# EAGLE schematic RU-PCBA-2X2-001-03 (EAGLE 9.7.0), part 3 of 5
## Sheet 7 of 17: Row 7
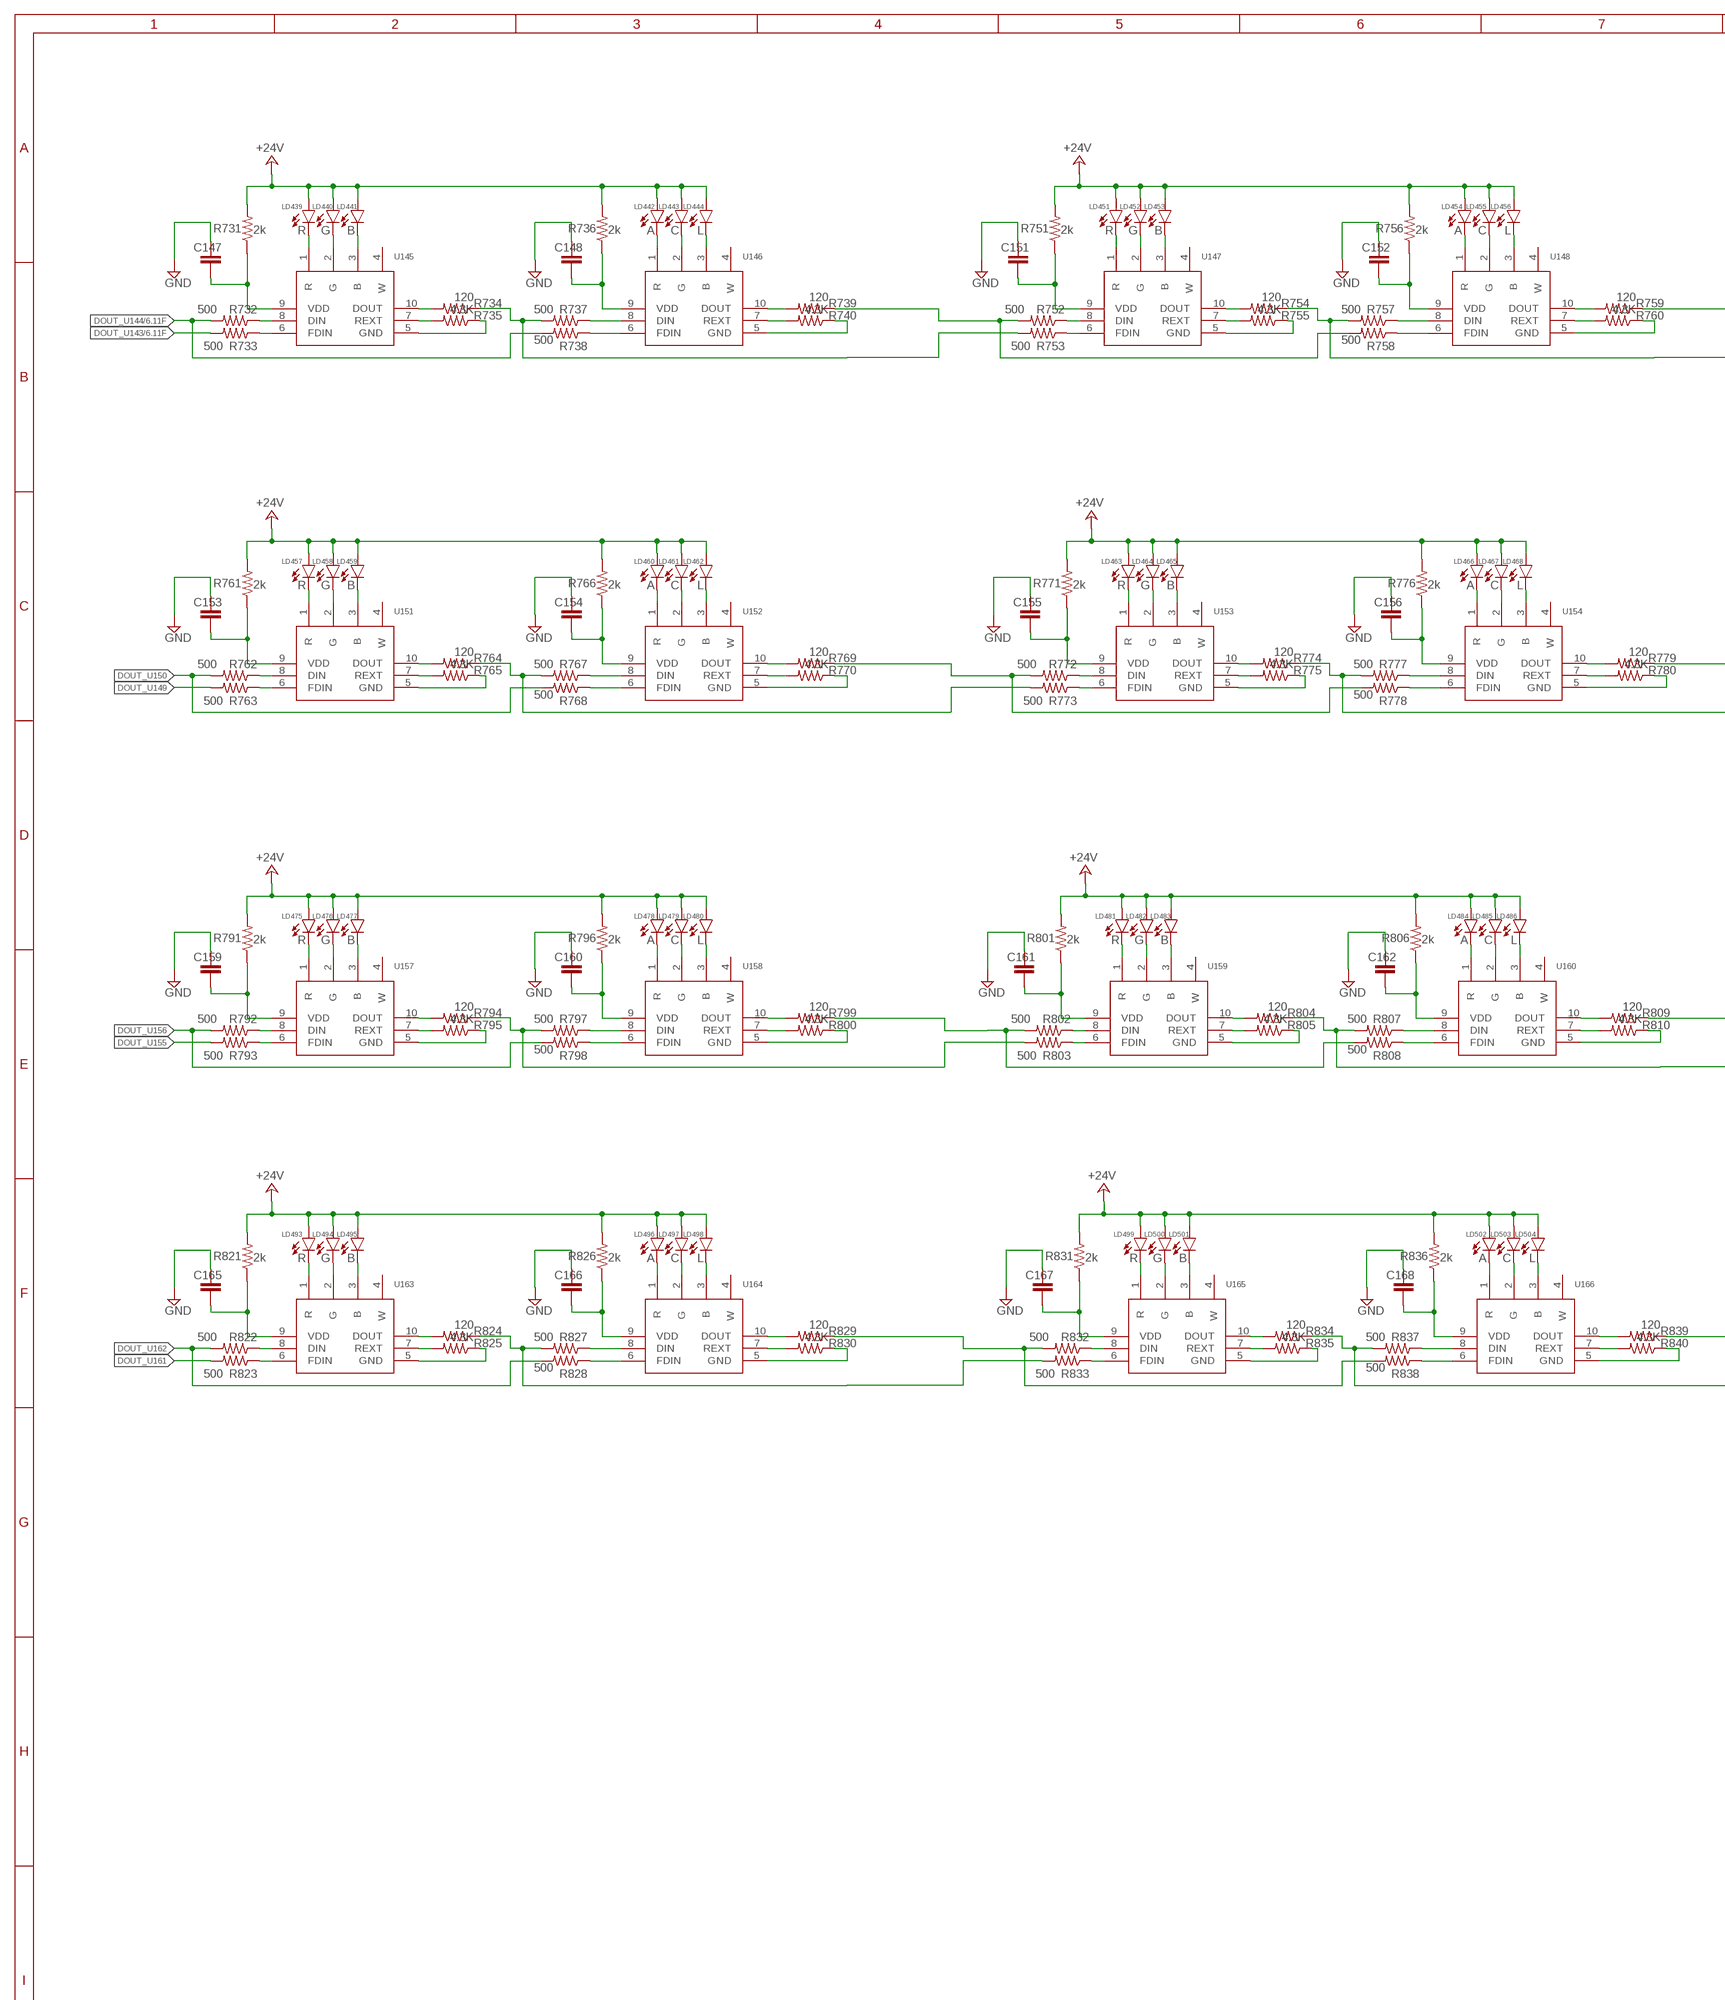
[diagram p12: schematic, sheet 7, part 1 of 2]
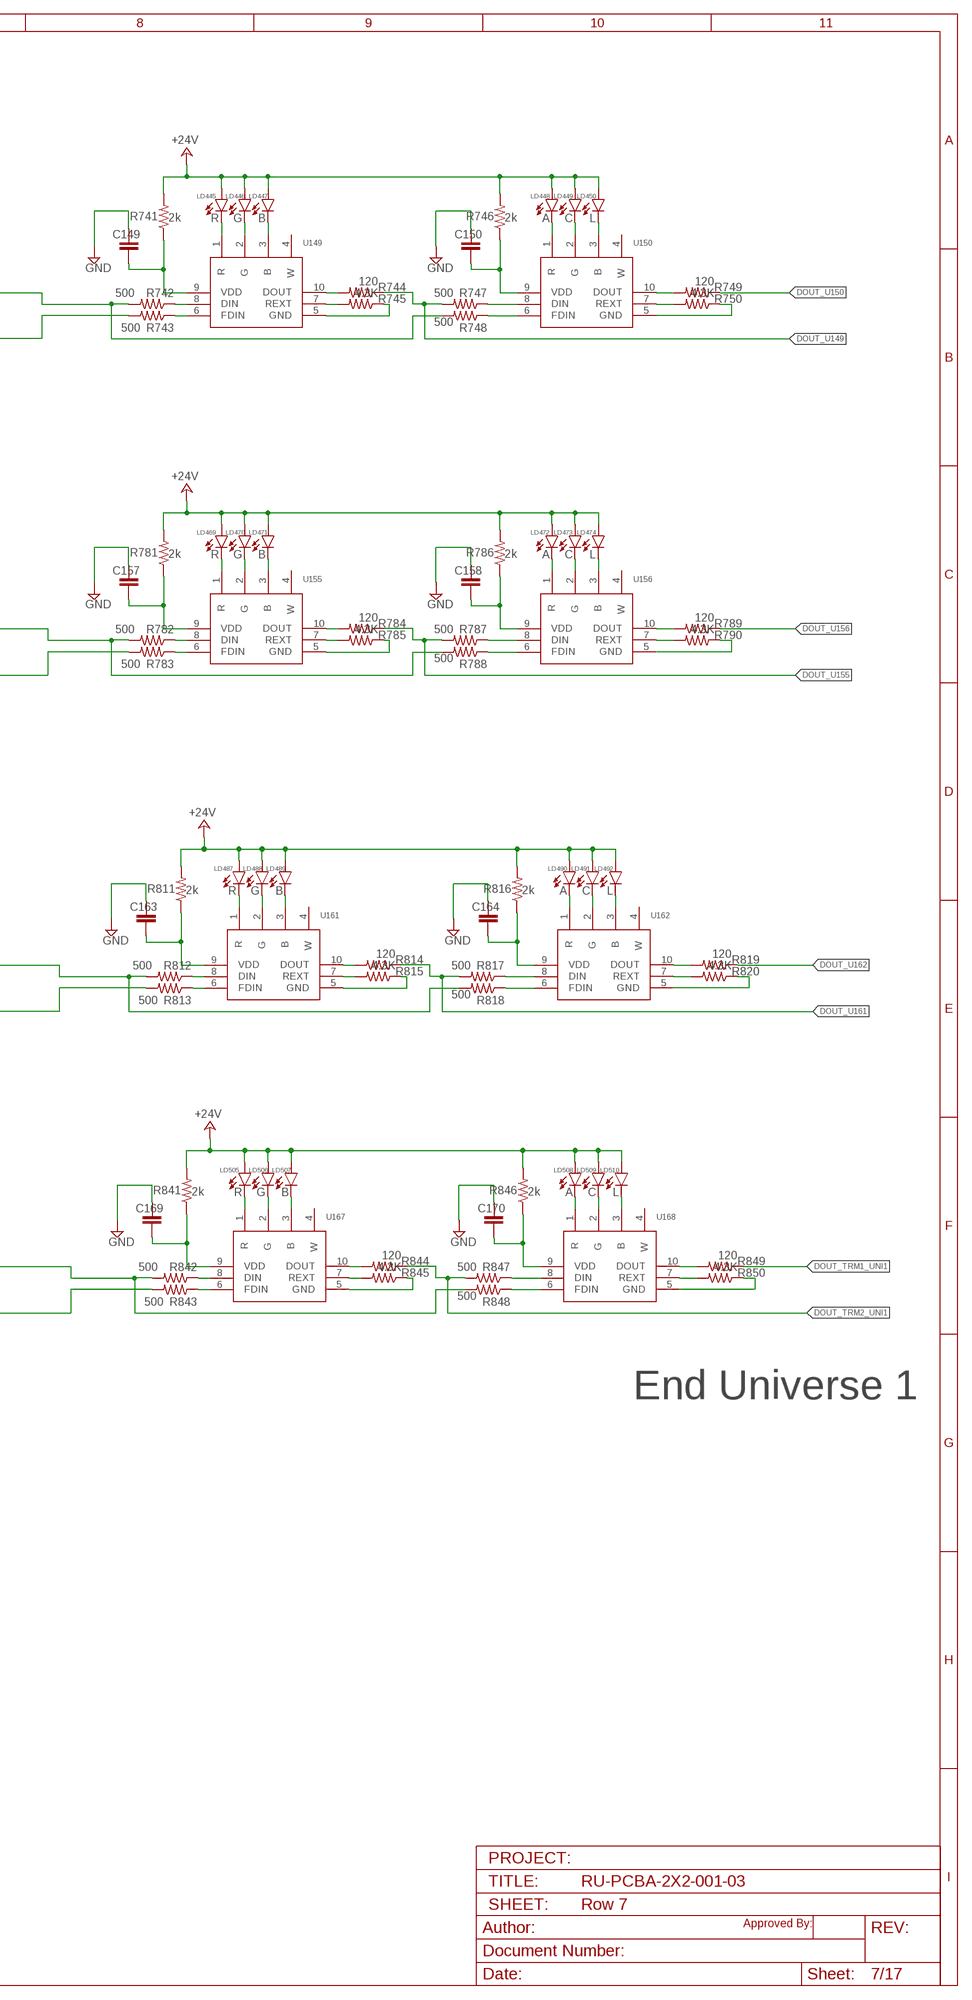
[diagram p13: schematic, sheet 7, part 2 of 2]

### Parts
C147  C-EUC1206  [C1206]
C148  C-EUC1206  [C1206]
C149  C-EUC1206  [C1206]
C150  C-EUC1206  [C1206]
C151  C-EUC1206  [C1206]
C152  C-EUC1206  [C1206]
C153  C-EUC1206  [C1206]
C154  C-EUC1206  [C1206]
C155  C-EUC1206  [C1206]
C156  C-EUC1206  [C1206]
C157  C-EUC1206  [C1206]
C158  C-EUC1206  [C1206]
C159  C-EUC1206  [C1206]
C160  C-EUC1206  [C1206]
C161  C-EUC1206  [C1206]
C162  C-EUC1206  [C1206]
C163  C-EUC1206  [C1206]
C164  C-EUC1206  [C1206]
C165  C-EUC1206  [C1206]
C166  C-EUC1206  [C1206]
C167  C-EUC1206  [C1206]
C168  C-EUC1206  [C1206]
C169  C-EUC1206  [C1206]
C170  C-EUC1206  [C1206]
LD439  R  5050LED  [5050LED]
LD440  G  5050LED  [5050LED]
LD441  B  5050LED  [5050LED]
LD442  A  5050LED  [5050LED]
LD443  C  5050LED  [5050LED]
LD444  L  5050LED  [5050LED]
LD445  R  5050LED  [5050LED]
LD446  G  5050LED  [5050LED]
LD447  B  5050LED  [5050LED]
LD448  A  5050LED  [5050LED]
LD449  C  5050LED  [5050LED]
LD450  L  5050LED  [5050LED]
LD451  R  5050LED  [5050LED]
LD452  G  5050LED  [5050LED]
LD453  B  5050LED  [5050LED]
LD454  A  5050LED  [5050LED]
LD455  C  5050LED  [5050LED]
LD456  L  5050LED  [5050LED]
LD457  R  5050LED  [5050LED]
LD458  G  5050LED  [5050LED]
LD459  B  5050LED  [5050LED]
LD460  A  5050LED  [5050LED]
LD461  C  5050LED  [5050LED]
LD462  L  5050LED  [5050LED]
LD463  R  5050LED  [5050LED]
LD464  G  5050LED  [5050LED]
LD465  B  5050LED  [5050LED]
LD466  A  5050LED  [5050LED]
LD467  C  5050LED  [5050LED]
LD468  L  5050LED  [5050LED]
LD469  R  5050LED  [5050LED]
LD470  G  5050LED  [5050LED]
LD471  B  5050LED  [5050LED]
LD472  A  5050LED  [5050LED]
LD473  C  5050LED  [5050LED]
LD474  L  5050LED  [5050LED]
LD475  R  5050LED  [5050LED]
LD476  G  5050LED  [5050LED]
LD477  B  5050LED  [5050LED]
LD478  A  5050LED  [5050LED]
LD479  C  5050LED  [5050LED]
LD480  L  5050LED  [5050LED]
LD481  R  5050LED  [5050LED]
LD482  G  5050LED  [5050LED]
LD483  B  5050LED  [5050LED]
LD484  A  5050LED  [5050LED]
LD485  C  5050LED  [5050LED]
LD486  L  5050LED  [5050LED]
LD487  R  5050LED  [5050LED]
LD488  G  5050LED  [5050LED]
LD489  B  5050LED  [5050LED]
LD490  A  5050LED  [5050LED]
LD491  C  5050LED  [5050LED]
LD492  L  5050LED  [5050LED]
LD493  R  5050LED  [5050LED]
LD494  G  5050LED  [5050LED]
LD495  B  5050LED  [5050LED]
LD496  A  5050LED  [5050LED]
LD497  C  5050LED  [5050LED]
LD498  L  5050LED  [5050LED]
LD499  R  5050LED  [5050LED]
LD500  G  5050LED  [5050LED]
LD501  B  5050LED  [5050LED]
LD502  A  5050LED  [5050LED]
LD503  C  5050LED  [5050LED]
LD504  L  5050LED  [5050LED]
LD505  R  5050LED  [5050LED]
LD506  G  5050LED  [5050LED]
LD507  B  5050LED  [5050LED]
LD508  A  5050LED  [5050LED]
LD509  C  5050LED  [5050LED]
LD510  L  5050LED  [5050LED]
R731  2k  R-US_R1206  [R1206]
R732  500  R-US_R0805  [R0805]
R733  500  R-US_R0805  [R0805]
R734  120  R-US_R0805  [R0805]
R735  4.3K  R-US_R0805  [R0805]
R736  2k  R-US_R1206  [R1206]
R737  500  R-US_R0805  [R0805]
R738  500  R-US_R0805  [R0805]
R739  120  R-US_R0805  [R0805]
R740  4.3K  R-US_R0805  [R0805]
R741  2k  R-US_R1206  [R1206]
R742  500  R-US_R0805  [R0805]
R743  500  R-US_R0805  [R0805]
R744  120  R-US_R0805  [R0805]
R745  4.3K  R-US_R0805  [R0805]
R746  2k  R-US_R1206  [R1206]
R747  500  R-US_R0805  [R0805]
R748  500  R-US_R0805  [R0805]
R749  120  R-US_R0805  [R0805]
R750  4.3K  R-US_R0805  [R0805]
R751  2k  R-US_R1206  [R1206]
R752  500  R-US_R0805  [R0805]
R753  500  R-US_R0805  [R0805]
R754  120  R-US_R0805  [R0805]
R755  4.3K  R-US_R0805  [R0805]
R756  2k  R-US_R1206  [R1206]
R757  500  R-US_R0805  [R0805]
R758  500  R-US_R0805  [R0805]
R759  120  R-US_R0805  [R0805]
R760  4.3K  R-US_R0805  [R0805]
R761  2k  R-US_R1206  [R1206]
R762  500  R-US_R0805  [R0805]
R763  500  R-US_R0805  [R0805]
R764  120  R-US_R0805  [R0805]
R765  4.3K  R-US_R0805  [R0805]
R766  2k  R-US_R1206  [R1206]
R767  500  R-US_R0805  [R0805]
R768  500  R-US_R0805  [R0805]
R769  120  R-US_R0805  [R0805]
R770  4.3K  R-US_R0805  [R0805]
R771  2k  R-US_R1206  [R1206]
R772  500  R-US_R0805  [R0805]
R773  500  R-US_R0805  [R0805]
R774  120  R-US_R0805  [R0805]
R775  4.3K  R-US_R0805  [R0805]
R776  2k  R-US_R1206  [R1206]
R777  500  R-US_R0805  [R0805]
R778  500  R-US_R0805  [R0805]
R779  120  R-US_R0805  [R0805]
R780  4.3K  R-US_R0805  [R0805]
R781  2k  R-US_R1206  [R1206]
R782  500  R-US_R0805  [R0805]
R783  500  R-US_R0805  [R0805]
R784  120  R-US_R0805  [R0805]
R785  4.3K  R-US_R0805  [R0805]
R786  2k  R-US_R1206  [R1206]
R787  500  R-US_R0805  [R0805]
R788  500  R-US_R0805  [R0805]
R789  120  R-US_R0805  [R0805]
R790  4.3K  R-US_R0805  [R0805]
R791  2k  R-US_R1206  [R1206]
R792  500  R-US_R0805  [R0805]
R793  500  R-US_R0805  [R0805]
R794  120  R-US_R0805  [R0805]
R795  4.3K  R-US_R0805  [R0805]
R796  2k  R-US_R1206  [R1206]
R797  500  R-US_R0805  [R0805]
R798  500  R-US_R0805  [R0805]
R799  120  R-US_R0805  [R0805]
R800  4.3K  R-US_R0805  [R0805]
R801  2k  R-US_R1206  [R1206]
R802  500  R-US_R0805  [R0805]
R803  500  R-US_R0805  [R0805]
R804  120  R-US_R0805  [R0805]
R805  4.3K  R-US_R0805  [R0805]
R806  2k  R-US_R1206  [R1206]
R807  500  R-US_R0805  [R0805]
R808  500  R-US_R0805  [R0805]
R809  120  R-US_R0805  [R0805]
R810  4.3K  R-US_R0805  [R0805]
R811  2k  R-US_R1206  [R1206]
R812  500  R-US_R0805  [R0805]
R813  500  R-US_R0805  [R0805]
R814  120  R-US_R0805  [R0805]
R815  4.3K  R-US_R0805  [R0805]
R816  2k  R-US_R1206  [R1206]
R817  500  R-US_R0805  [R0805]
R818  500  R-US_R0805  [R0805]
R819  120  R-US_R0805  [R0805]
R820  4.3K  R-US_R0805  [R0805]
R821  2k  R-US_R1206  [R1206]
R822  500  R-US_R0805  [R0805]
R823  500  R-US_R0805  [R0805]
R824  120  R-US_R0805  [R0805]
R825  4.3K  R-US_R0805  [R0805]
R826  2k  R-US_R1206  [R1206]
R827  500  R-US_R0805  [R0805]
R828  500  R-US_R0805  [R0805]
R829  120  R-US_R0805  [R0805]
R830  4.3K  R-US_R0805  [R0805]
R831  2k  R-US_R1206  [R1206]
R832  500  R-US_R0805  [R0805]
R833  500  R-US_R0805  [R0805]
R834  120  R-US_R0805  [R0805]
R835  4.3K  R-US_R0805  [R0805]
R836  2k  R-US_R1206  [R1206]
R837  500  R-US_R0805  [R0805]
R838  500  R-US_R0805  [R0805]
R839  120  R-US_R0805  [R0805]
R840  4.3K  R-US_R0805  [R0805]
R841  2k  R-US_R1206  [R1206]
R842  500  R-US_R0805  [R0805]
R843  500  R-US_R0805  [R0805]
R844  120  R-US_R0805  [R0805]
R845  4.3K  R-US_R0805  [R0805]
R846  2k  R-US_R1206  [R1206]
R847  500  R-US_R0805  [R0805]
R848  500  R-US_R0805  [R0805]
R849  120  R-US_R0805  [R0805]
R850  4.3K  R-US_R0805  [R0805]
U145  UCS7604  [SOP100P600X175-10N]
U146  UCS7604  [SOP100P600X175-10N]
U147  UCS7604  [SOP100P600X175-10N]
U148  UCS7604  [SOP100P600X175-10N]
U149  UCS7604  [SOP100P600X175-10N]
U150  UCS7604  [SOP100P600X175-10N]
U151  UCS7604  [SOP100P600X175-10N]
U152  UCS7604  [SOP100P600X175-10N]
U153  UCS7604  [SOP100P600X175-10N]
U154  UCS7604  [SOP100P600X175-10N]
U155  UCS7604  [SOP100P600X175-10N]
U156  UCS7604  [SOP100P600X175-10N]
U157  UCS7604  [SOP100P600X175-10N]
U158  UCS7604  [SOP100P600X175-10N]
U159  UCS7604  [SOP100P600X175-10N]
U160  UCS7604  [SOP100P600X175-10N]
U161  UCS7604  [SOP100P600X175-10N]
U162  UCS7604  [SOP100P600X175-10N]
U163  UCS7604  [SOP100P600X175-10N]
U164  UCS7604  [SOP100P600X175-10N]
U165  UCS7604  [SOP100P600X175-10N]
U166  UCS7604  [SOP100P600X175-10N]
U167  UCS7604  [SOP100P600X175-10N]
U168  UCS7604  [SOP100P600X175-10N]

### Nets
+24V: LD439.A LD440.A LD441.A LD442.A LD443.A LD444.A LD445.A LD446.A LD447.A LD448.A LD449.A LD450.A LD451.A LD452.A LD453.A LD454.A LD455.A LD456.A LD457.A LD458.A LD459.A LD460.A LD461.A LD462.A LD463.A LD464.A LD465.A LD466.A LD467.A LD468.A LD469.A LD470.A LD471.A LD472.A LD473.A LD474.A LD475.A LD476.A LD477.A LD478.A LD479.A LD480.A LD481.A LD482.A LD483.A LD484.A LD485.A LD486.A LD487.A LD488.A LD489.A LD490.A LD491.A LD492.A LD493.A LD494.A LD495.A LD496.A LD497.A LD498.A LD499.A LD500.A LD501.A LD502.A LD503.A LD504.A LD505.A LD506.A LD507.A LD508.A LD509.A LD510.A R731.2 R736.2 R741.2 R746.2 R751.2 R756.2 R761.2 R766.2 R771.2 R776.2 R781.2 R786.2 R791.2 R796.2 R801.2 R806.2 R811.2 R816.2 R821.2 R826.2 R831.2 R836.2 R841.2 R846.2 ; also sheet 1,2,3,4,5,6,8,9,10,11,12,13,14
DOUT_TRM1_UNI1: R849.1
DOUT_TRM2_UNI1: R844.1 R847.2
DOUT_U143: R733.2 ; also sheet 6
DOUT_U144: R732.2 R738.2 ; also sheet 6
DOUT_U149: R744.1 R747.2 R763.2
DOUT_U150: R749.1 R762.2 R768.2
DOUT_U155: R784.1 R787.2 R793.2
DOUT_U156: R789.1 R792.2 R798.2
DOUT_U161: R814.1 R817.2 R823.2
DOUT_U162: R819.1 R822.2 R828.2
GND: C147.2 C148.2 C149.2 C150.2 C151.2 C152.2 C153.2 C154.2 C155.2 C156.2 C157.2 C158.2 C159.2 C160.2 C161.2 C162.2 C163.2 C164.2 C165.2 C166.2 C167.2 C168.2 C169.2 C170.2 R735.1 R740.1 R745.1 R750.1 R755.1 R760.1 R765.1 R770.1 R775.1 R780.1 R785.1 R790.1 R795.1 R800.1 R805.1 R810.1 R815.1 R820.1 R825.1 R830.1 R835.1 R840.1 R845.1 R850.1 U145.5(GND) U146.5(GND) U147.5(GND) U148.5(GND) U149.5(GND) U150.5(GND) U151.5(GND) U152.5(GND) U153.5(GND) U154.5(GND) U155.5(GND) U156.5(GND) U157.5(GND) U158.5(GND) U159.5(GND) U160.5(GND) U161.5(GND) U162.5(GND) U163.5(GND) U164.5(GND) U165.5(GND) U166.5(GND) U167.5(GND) U168.5(GND) ; also sheet 1,2,3,4,5,6,8,9,10,11,12,13,14
N$1493: C147.1 R731.1 U145.9(VDD)
N$1494: LD439.K(C) U145.1(R)
N$1495: LD440.K(C) U145.2(G)
N$1496: LD441.K(C) U145.3(B)
N$1497: R732.1 U145.8(DIN)
N$1498: R733.1 U145.6(FDIN)
N$1499: R734.2 U145.10(DOUT)
N$1500: R735.2 U145.7(REXT)
N$1501: LD442.K(C) U146.1(R)
N$1502: LD443.K(C) U146.2(G)
N$1503: LD444.K(C) U146.3(B)
N$1504: C148.1 R736.1 U146.9(VDD)
N$1505: R737.1 U146.8(DIN)
N$1507: R738.1 U146.6(FDIN)
N$1510: R739.2 U146.10(DOUT)
N$1511: R740.2 U146.7(REXT)
N$1512: R739.1 R752.2 R758.2
N$1513: C149.1 R741.1 U149.9(VDD)
N$1514: LD445.K(C) U149.1(R)
N$1515: LD446.K(C) U149.2(G)
N$1516: LD447.K(C) U149.3(B)
N$1517: R742.1 U149.8(DIN)
N$1518: R743.1 U149.6(FDIN)
N$1519: R744.2 U149.10(DOUT)
N$1520: R745.2 U149.7(REXT)
N$1521: LD448.K(C) U150.1(R)
N$1522: LD449.K(C) U150.2(G)
N$1523: LD450.K(C) U150.3(B)
N$1524: C150.1 R746.1 U150.9(VDD)
N$1525: R747.1 U150.8(DIN)
N$1527: R748.1 U150.6(FDIN)
N$1529: R743.2 R754.1 R757.2
N$1530: R749.2 U150.10(DOUT)
N$1531: R750.2 U150.7(REXT)
N$1533: C151.1 R751.1 U147.9(VDD)
N$1534: LD451.K(C) U147.1(R)
N$1535: LD452.K(C) U147.2(G)
N$1536: LD453.K(C) U147.3(B)
N$1537: R752.1 U147.8(DIN)
N$1538: R753.1 U147.6(FDIN)
N$1539: R754.2 U147.10(DOUT)
N$1540: R755.2 U147.7(REXT)
N$1541: LD454.K(C) U148.1(R)
N$1542: LD455.K(C) U148.2(G)
N$1543: LD456.K(C) U148.3(B)
N$1544: C152.1 R756.1 U148.9(VDD)
N$1545: R757.1 U148.8(DIN)
N$1547: R758.1 U148.6(FDIN)
N$1549: R734.1 R737.2 R753.2
N$1550: R759.2 U148.10(DOUT)
N$1551: R760.2 U148.7(REXT)
N$1552: R742.2 R748.2 R759.1
N$1553: C153.1 R761.1 U151.9(VDD)
N$1554: LD457.K(C) U151.1(R)
N$1555: LD458.K(C) U151.2(G)
N$1556: LD459.K(C) U151.3(B)
N$1557: R762.1 U151.8(DIN)
N$1558: R763.1 U151.6(FDIN)
N$1559: R764.2 U151.10(DOUT)
N$1560: R765.2 U151.7(REXT)
N$1561: LD460.K(C) U152.1(R)
N$1562: LD461.K(C) U152.2(G)
N$1563: LD462.K(C) U152.3(B)
N$1564: C154.1 R766.1 U152.9(VDD)
N$1565: R767.1 U152.8(DIN)
N$1567: R768.1 U152.6(FDIN)
N$1570: R769.2 U152.10(DOUT)
N$1571: R770.2 U152.7(REXT)
N$1572: R769.1 R772.2 R778.2
N$1573: C155.1 R771.1 U153.9(VDD)
N$1574: LD463.K(C) U153.1(R)
N$1575: LD464.K(C) U153.2(G)
N$1576: LD465.K(C) U153.3(B)
N$1577: R772.1 U153.8(DIN)
N$1578: R773.1 U153.6(FDIN)
N$1579: R774.2 U153.10(DOUT)
N$1580: R775.2 U153.7(REXT)
N$1581: LD466.K(C) U154.1(R)
N$1582: LD467.K(C) U154.2(G)
N$1583: LD468.K(C) U154.3(B)
N$1584: C156.1 R776.1 U154.9(VDD)
N$1585: R777.1 U154.8(DIN)
N$1587: R778.1 U154.6(FDIN)
N$1589: R764.1 R767.2 R773.2
N$1590: R779.2 U154.10(DOUT)
N$1591: R780.2 U154.7(REXT)
N$1592: R779.1 R782.2 R788.2
N$1593: C157.1 R781.1 U155.9(VDD)
N$1594: LD469.K(C) U155.1(R)
N$1595: LD470.K(C) U155.2(G)
N$1596: LD471.K(C) U155.3(B)
N$1597: R782.1 U155.8(DIN)
N$1598: R783.1 U155.6(FDIN)
N$1599: R784.2 U155.10(DOUT)
N$1600: R785.2 U155.7(REXT)
N$1601: LD472.K(C) U156.1(R)
N$1602: LD473.K(C) U156.2(G)
N$1603: LD474.K(C) U156.3(B)
N$1604: C158.1 R786.1 U156.9(VDD)
N$1605: R787.1 U156.8(DIN)
N$1607: R788.1 U156.6(FDIN)
N$1609: R774.1 R777.2 R783.2
N$1610: R789.2 U156.10(DOUT)
N$1611: R790.2 U156.7(REXT)
N$1613: C159.1 R791.1 U157.9(VDD)
N$1614: LD475.K(C) U157.1(R)
N$1615: LD476.K(C) U157.2(G)
N$1616: LD477.K(C) U157.3(B)
N$1617: R792.1 U157.8(DIN)
N$1618: R793.1 U157.6(FDIN)
N$1619: R794.2 U157.10(DOUT)
N$1620: R795.2 U157.7(REXT)
N$1621: LD478.K(C) U158.1(R)
N$1622: LD479.K(C) U158.2(G)
N$1623: LD480.K(C) U158.3(B)
N$1624: C160.1 R796.1 U158.9(VDD)
N$1625: R797.1 U158.8(DIN)
N$1627: R798.1 U158.6(FDIN)
N$1630: R799.2 U158.10(DOUT)
N$1631: R800.2 U158.7(REXT)
N$1632: R799.1 R802.2 R808.2
N$1633: C161.1 R801.1 U159.9(VDD)
N$1634: LD481.K(C) U159.1(R)
N$1635: LD482.K(C) U159.2(G)
N$1636: LD483.K(C) U159.3(B)
N$1637: R802.1 U159.8(DIN)
N$1638: R803.1 U159.6(FDIN)
N$1639: R804.2 U159.10(DOUT)
N$1640: R805.2 U159.7(REXT)
N$1641: LD484.K(C) U160.1(R)
N$1642: LD485.K(C) U160.2(G)
N$1643: LD486.K(C) U160.3(B)
N$1644: C162.1 R806.1 U160.9(VDD)
N$1645: R807.1 U160.8(DIN)
N$1647: R808.1 U160.6(FDIN)
N$1649: R794.1 R797.2 R803.2
N$1650: R809.2 U160.10(DOUT)
N$1651: R810.2 U160.7(REXT)
N$1652: R809.1 R812.2 R818.2
N$1653: C163.1 R811.1 U161.9(VDD)
N$1654: LD487.K(C) U161.1(R)
N$1655: LD488.K(C) U161.2(G)
N$1656: LD489.K(C) U161.3(B)
N$1657: R812.1 U161.8(DIN)
N$1658: R813.1 U161.6(FDIN)
N$1659: R814.2 U161.10(DOUT)
N$1660: R815.2 U161.7(REXT)
N$1661: LD490.K(C) U162.1(R)
N$1662: LD491.K(C) U162.2(G)
N$1663: LD492.K(C) U162.3(B)
N$1664: C164.1 R816.1 U162.9(VDD)
N$1665: R817.1 U162.8(DIN)
N$1667: R818.1 U162.6(FDIN)
N$1669: R804.1 R807.2 R813.2
N$1670: R819.2 U162.10(DOUT)
N$1671: R820.2 U162.7(REXT)
N$1673: C165.1 R821.1 U163.9(VDD)
N$1674: LD493.K(C) U163.1(R)
N$1675: LD494.K(C) U163.2(G)
N$1676: LD495.K(C) U163.3(B)
N$1677: R822.1 U163.8(DIN)
N$1678: R823.1 U163.6(FDIN)
N$1679: R824.2 U163.10(DOUT)
N$1680: R825.2 U163.7(REXT)
N$1681: LD496.K(C) U164.1(R)
N$1682: LD497.K(C) U164.2(G)
N$1683: LD498.K(C) U164.3(B)
N$1684: C166.1 R826.1 U164.9(VDD)
N$1685: R827.1 U164.8(DIN)
N$1687: R828.1 U164.6(FDIN)
N$1690: R829.2 U164.10(DOUT)
N$1691: R830.2 U164.7(REXT)
N$1692: R829.1 R832.2 R838.2
N$1693: C167.1 R831.1 U165.9(VDD)
N$1694: LD499.K(C) U165.1(R)
N$1695: LD500.K(C) U165.2(G)
N$1696: LD501.K(C) U165.3(B)
N$1697: R832.1 U165.8(DIN)
N$1698: R833.1 U165.6(FDIN)
N$1699: R834.2 U165.10(DOUT)
N$1700: R835.2 U165.7(REXT)
N$1701: LD502.K(C) U166.1(R)
N$1702: LD503.K(C) U166.2(G)
N$1703: LD504.K(C) U166.3(B)
N$1704: C168.1 R836.1 U166.9(VDD)
N$1705: R837.1 U166.8(DIN)
N$1706: R834.1 R837.2 R843.2
N$1707: R838.1 U166.6(FDIN)
N$1709: R824.1 R827.2 R833.2
N$1710: R839.2 U166.10(DOUT)
N$1711: R840.2 U166.7(REXT)
N$1712: R839.1 R842.2 R848.2
N$1713: C169.1 R841.1 U167.9(VDD)
N$1714: LD505.K(C) U167.1(R)
N$1715: LD506.K(C) U167.2(G)
N$1716: LD507.K(C) U167.3(B)
N$1717: R842.1 U167.8(DIN)
N$1718: R843.1 U167.6(FDIN)
N$1719: R844.2 U167.10(DOUT)
N$1720: R845.2 U167.7(REXT)
N$1721: LD508.K(C) U168.1(R)
N$1722: LD509.K(C) U168.2(G)
N$1723: LD510.K(C) U168.3(B)
N$1724: C170.1 R846.1 U168.9(VDD)
N$1725: R847.1 U168.8(DIN)
N$1727: R848.1 U168.6(FDIN)
N$1730: R849.2 U168.10(DOUT)
N$1731: R850.2 U168.7(REXT)
Unconnected: U145.4(W) U146.4(W) U147.4(W) U148.4(W) U149.4(W) U150.4(W) U151.4(W) U152.4(W) U153.4(W) U154.4(W) U155.4(W) U156.4(W) U157.4(W) U158.4(W) U159.4(W) U160.4(W) U161.4(W) U162.4(W) U163.4(W) U164.4(W) U165.4(W) U166.4(W) U167.4(W) U168.4(W)

### Notes on the sheet
- End Universe 1

## Sheet 8 of 17: Row 8
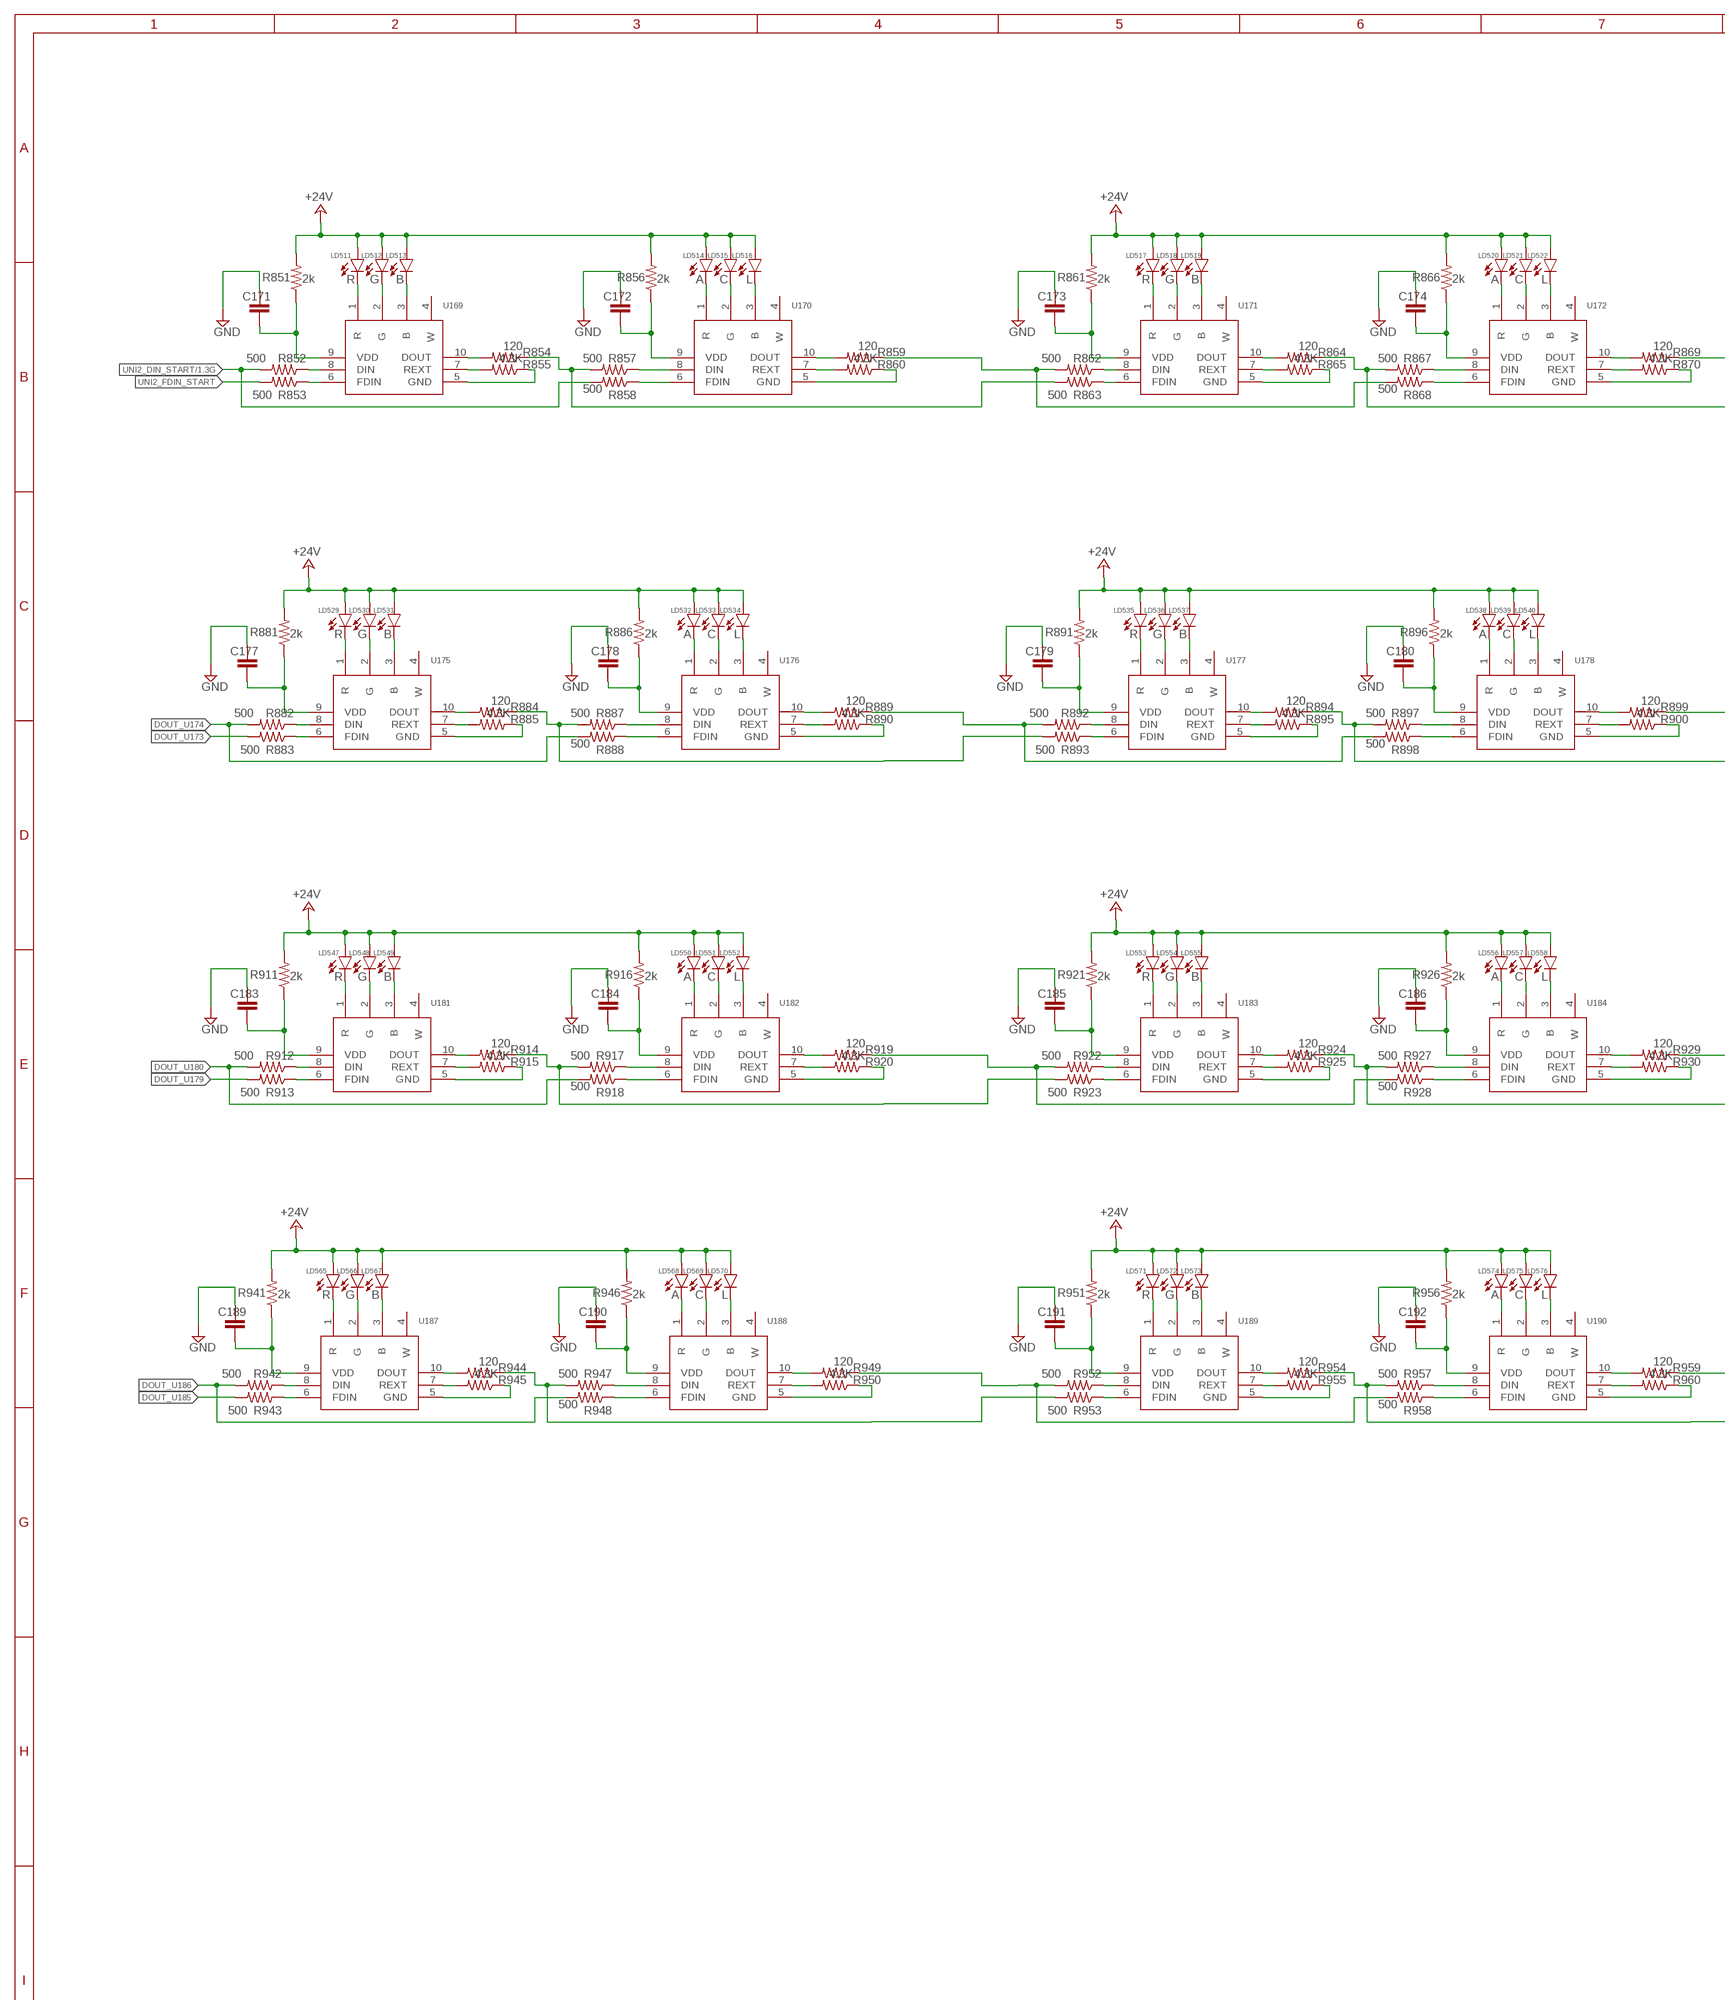
[diagram p14: schematic, sheet 8, part 1 of 2]
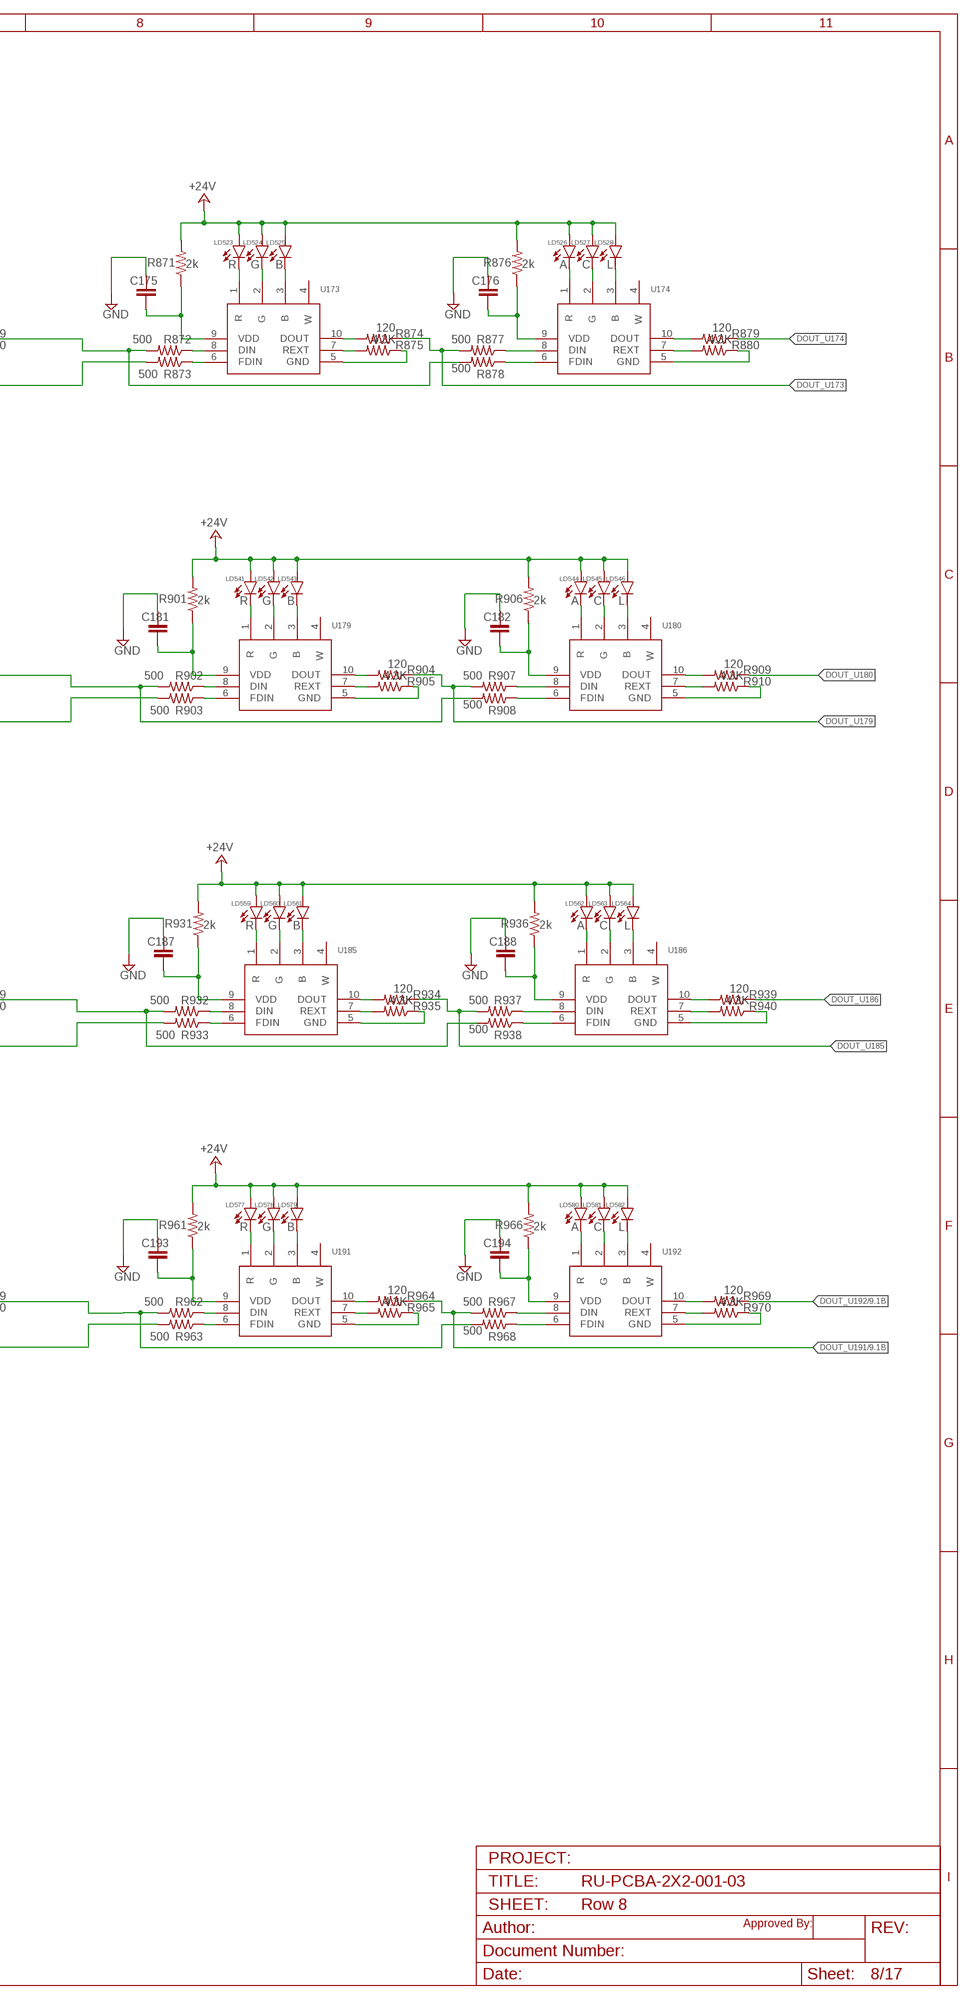
[diagram p15: schematic, sheet 8, part 2 of 2]

### Parts
C171  C-EUC1206  [C1206]
C172  C-EUC1206  [C1206]
C173  C-EUC1206  [C1206]
C174  C-EUC1206  [C1206]
C175  C-EUC1206  [C1206]
C176  C-EUC1206  [C1206]
C177  C-EUC1206  [C1206]
C178  C-EUC1206  [C1206]
C179  C-EUC1206  [C1206]
C180  C-EUC1206  [C1206]
C181  C-EUC1206  [C1206]
C182  C-EUC1206  [C1206]
C183  C-EUC1206  [C1206]
C184  C-EUC1206  [C1206]
C185  C-EUC1206  [C1206]
C186  C-EUC1206  [C1206]
C187  C-EUC1206  [C1206]
C188  C-EUC1206  [C1206]
C189  C-EUC1206  [C1206]
C190  C-EUC1206  [C1206]
C191  C-EUC1206  [C1206]
C192  C-EUC1206  [C1206]
C193  C-EUC1206  [C1206]
C194  C-EUC1206  [C1206]
LD511  R  5050LED  [5050LED]
LD512  G  5050LED  [5050LED]
LD513  B  5050LED  [5050LED]
LD514  A  5050LED  [5050LED]
LD515  C  5050LED  [5050LED]
LD516  L  5050LED  [5050LED]
LD517  R  5050LED  [5050LED]
LD518  G  5050LED  [5050LED]
LD519  B  5050LED  [5050LED]
LD520  A  5050LED  [5050LED]
LD521  C  5050LED  [5050LED]
LD522  L  5050LED  [5050LED]
LD523  R  5050LED  [5050LED]
LD524  G  5050LED  [5050LED]
LD525  B  5050LED  [5050LED]
LD526  A  5050LED  [5050LED]
LD527  C  5050LED  [5050LED]
LD528  L  5050LED  [5050LED]
LD529  R  5050LED  [5050LED]
LD530  G  5050LED  [5050LED]
LD531  B  5050LED  [5050LED]
LD532  A  5050LED  [5050LED]
LD533  C  5050LED  [5050LED]
LD534  L  5050LED  [5050LED]
LD535  R  5050LED  [5050LED]
LD536  G  5050LED  [5050LED]
LD537  B  5050LED  [5050LED]
LD538  A  5050LED  [5050LED]
LD539  C  5050LED  [5050LED]
LD540  L  5050LED  [5050LED]
LD541  R  5050LED  [5050LED]
LD542  G  5050LED  [5050LED]
LD543  B  5050LED  [5050LED]
LD544  A  5050LED  [5050LED]
LD545  C  5050LED  [5050LED]
LD546  L  5050LED  [5050LED]
LD547  R  5050LED  [5050LED]
LD548  G  5050LED  [5050LED]
LD549  B  5050LED  [5050LED]
LD550  A  5050LED  [5050LED]
LD551  C  5050LED  [5050LED]
LD552  L  5050LED  [5050LED]
LD553  R  5050LED  [5050LED]
LD554  G  5050LED  [5050LED]
LD555  B  5050LED  [5050LED]
LD556  A  5050LED  [5050LED]
LD557  C  5050LED  [5050LED]
LD558  L  5050LED  [5050LED]
LD559  R  5050LED  [5050LED]
LD560  G  5050LED  [5050LED]
LD561  B  5050LED  [5050LED]
LD562  A  5050LED  [5050LED]
LD563  C  5050LED  [5050LED]
LD564  L  5050LED  [5050LED]
LD565  R  5050LED  [5050LED]
LD566  G  5050LED  [5050LED]
LD567  B  5050LED  [5050LED]
LD568  A  5050LED  [5050LED]
LD569  C  5050LED  [5050LED]
LD570  L  5050LED  [5050LED]
LD571  R  5050LED  [5050LED]
LD572  G  5050LED  [5050LED]
LD573  B  5050LED  [5050LED]
LD574  A  5050LED  [5050LED]
LD575  C  5050LED  [5050LED]
LD576  L  5050LED  [5050LED]
LD577  R  5050LED  [5050LED]
LD578  G  5050LED  [5050LED]
LD579  B  5050LED  [5050LED]
LD580  A  5050LED  [5050LED]
LD581  C  5050LED  [5050LED]
LD582  L  5050LED  [5050LED]
R851  2k  R-US_R1206  [R1206]
R852  500  R-US_R0805  [R0805]
R853  500  R-US_R0805  [R0805]
R854  120  R-US_R0805  [R0805]
R855  4.3K  R-US_R0805  [R0805]
R856  2k  R-US_R1206  [R1206]
R857  500  R-US_R0805  [R0805]
R858  500  R-US_R0805  [R0805]
R859  120  R-US_R0805  [R0805]
R860  4.3K  R-US_R0805  [R0805]
R861  2k  R-US_R1206  [R1206]
R862  500  R-US_R0805  [R0805]
R863  500  R-US_R0805  [R0805]
R864  120  R-US_R0805  [R0805]
R865  4.3K  R-US_R0805  [R0805]
R866  2k  R-US_R1206  [R1206]
R867  500  R-US_R0805  [R0805]
R868  500  R-US_R0805  [R0805]
R869  120  R-US_R0805  [R0805]
R870  4.3K  R-US_R0805  [R0805]
R871  2k  R-US_R1206  [R1206]
R872  500  R-US_R0805  [R0805]
R873  500  R-US_R0805  [R0805]
R874  120  R-US_R0805  [R0805]
R875  4.3K  R-US_R0805  [R0805]
R876  2k  R-US_R1206  [R1206]
R877  500  R-US_R0805  [R0805]
R878  500  R-US_R0805  [R0805]
R879  120  R-US_R0805  [R0805]
R880  4.3K  R-US_R0805  [R0805]
R881  2k  R-US_R1206  [R1206]
R882  500  R-US_R0805  [R0805]
R883  500  R-US_R0805  [R0805]
R884  120  R-US_R0805  [R0805]
R885  4.3K  R-US_R0805  [R0805]
R886  2k  R-US_R1206  [R1206]
R887  500  R-US_R0805  [R0805]
R888  500  R-US_R0805  [R0805]
R889  120  R-US_R0805  [R0805]
R890  4.3K  R-US_R0805  [R0805]
R891  2k  R-US_R1206  [R1206]
R892  500  R-US_R0805  [R0805]
R893  500  R-US_R0805  [R0805]
R894  120  R-US_R0805  [R0805]
R895  4.3K  R-US_R0805  [R0805]
R896  2k  R-US_R1206  [R1206]
R897  500  R-US_R0805  [R0805]
R898  500  R-US_R0805  [R0805]
R899  120  R-US_R0805  [R0805]
R900  4.3K  R-US_R0805  [R0805]
R901  2k  R-US_R1206  [R1206]
R902  500  R-US_R0805  [R0805]
R903  500  R-US_R0805  [R0805]
R904  120  R-US_R0805  [R0805]
R905  4.3K  R-US_R0805  [R0805]
R906  2k  R-US_R1206  [R1206]
R907  500  R-US_R0805  [R0805]
R908  500  R-US_R0805  [R0805]
R909  120  R-US_R0805  [R0805]
R910  4.3K  R-US_R0805  [R0805]
R911  2k  R-US_R1206  [R1206]
R912  500  R-US_R0805  [R0805]
R913  500  R-US_R0805  [R0805]
R914  120  R-US_R0805  [R0805]
R915  4.3K  R-US_R0805  [R0805]
R916  2k  R-US_R1206  [R1206]
R917  500  R-US_R0805  [R0805]
R918  500  R-US_R0805  [R0805]
R919  120  R-US_R0805  [R0805]
R920  4.3K  R-US_R0805  [R0805]
R921  2k  R-US_R1206  [R1206]
R922  500  R-US_R0805  [R0805]
R923  500  R-US_R0805  [R0805]
R924  120  R-US_R0805  [R0805]
R925  4.3K  R-US_R0805  [R0805]
R926  2k  R-US_R1206  [R1206]
R927  500  R-US_R0805  [R0805]
R928  500  R-US_R0805  [R0805]
R929  120  R-US_R0805  [R0805]
R930  4.3K  R-US_R0805  [R0805]
R931  2k  R-US_R1206  [R1206]
R932  500  R-US_R0805  [R0805]
R933  500  R-US_R0805  [R0805]
R934  120  R-US_R0805  [R0805]
R935  4.3K  R-US_R0805  [R0805]
R936  2k  R-US_R1206  [R1206]
R937  500  R-US_R0805  [R0805]
R938  500  R-US_R0805  [R0805]
R939  120  R-US_R0805  [R0805]
R940  4.3K  R-US_R0805  [R0805]
R941  2k  R-US_R1206  [R1206]
R942  500  R-US_R0805  [R0805]
R943  500  R-US_R0805  [R0805]
R944  120  R-US_R0805  [R0805]
R945  4.3K  R-US_R0805  [R0805]
R946  2k  R-US_R1206  [R1206]
R947  500  R-US_R0805  [R0805]
R948  500  R-US_R0805  [R0805]
R949  120  R-US_R0805  [R0805]
R950  4.3K  R-US_R0805  [R0805]
R951  2k  R-US_R1206  [R1206]
R952  500  R-US_R0805  [R0805]
R953  500  R-US_R0805  [R0805]
R954  120  R-US_R0805  [R0805]
R955  4.3K  R-US_R0805  [R0805]
R956  2k  R-US_R1206  [R1206]
R957  500  R-US_R0805  [R0805]
R958  500  R-US_R0805  [R0805]
R959  120  R-US_R0805  [R0805]
R960  4.3K  R-US_R0805  [R0805]
R961  2k  R-US_R1206  [R1206]
R962  500  R-US_R0805  [R0805]
R963  500  R-US_R0805  [R0805]
R964  120  R-US_R0805  [R0805]
R965  4.3K  R-US_R0805  [R0805]
R966  2k  R-US_R1206  [R1206]
R967  500  R-US_R0805  [R0805]
R968  500  R-US_R0805  [R0805]
R969  120  R-US_R0805  [R0805]
R970  4.3K  R-US_R0805  [R0805]
U169  UCS7604  [SOP100P600X175-10N]
U170  UCS7604  [SOP100P600X175-10N]
U171  UCS7604  [SOP100P600X175-10N]
U172  UCS7604  [SOP100P600X175-10N]
U173  UCS7604  [SOP100P600X175-10N]
U174  UCS7604  [SOP100P600X175-10N]
U175  UCS7604  [SOP100P600X175-10N]
U176  UCS7604  [SOP100P600X175-10N]
U177  UCS7604  [SOP100P600X175-10N]
U178  UCS7604  [SOP100P600X175-10N]
U179  UCS7604  [SOP100P600X175-10N]
U180  UCS7604  [SOP100P600X175-10N]
U181  UCS7604  [SOP100P600X175-10N]
U182  UCS7604  [SOP100P600X175-10N]
U183  UCS7604  [SOP100P600X175-10N]
U184  UCS7604  [SOP100P600X175-10N]
U185  UCS7604  [SOP100P600X175-10N]
U186  UCS7604  [SOP100P600X175-10N]
U187  UCS7604  [SOP100P600X175-10N]
U188  UCS7604  [SOP100P600X175-10N]
U189  UCS7604  [SOP100P600X175-10N]
U190  UCS7604  [SOP100P600X175-10N]
U191  UCS7604  [SOP100P600X175-10N]
U192  UCS7604  [SOP100P600X175-10N]

### Nets
+24V: LD511.A LD512.A LD513.A LD514.A LD515.A LD516.A LD517.A LD518.A LD519.A LD520.A LD521.A LD522.A LD523.A LD524.A LD525.A LD526.A LD527.A LD528.A LD529.A LD530.A LD531.A LD532.A LD533.A LD534.A LD535.A LD536.A LD537.A LD538.A LD539.A LD540.A LD541.A LD542.A LD543.A LD544.A LD545.A LD546.A LD547.A LD548.A LD549.A LD550.A LD551.A LD552.A LD553.A LD554.A LD555.A LD556.A LD557.A LD558.A LD559.A LD560.A LD561.A LD562.A LD563.A LD564.A LD565.A LD566.A LD567.A LD568.A LD569.A LD570.A LD571.A LD572.A LD573.A LD574.A LD575.A LD576.A LD577.A LD578.A LD579.A LD580.A LD581.A LD582.A R851.2 R856.2 R861.2 R866.2 R871.2 R876.2 R881.2 R886.2 R891.2 R896.2 R901.2 R906.2 R911.2 R916.2 R921.2 R926.2 R931.2 R936.2 R941.2 R946.2 R951.2 R956.2 R961.2 R966.2 ; also sheet 1,2,3,4,5,6,7,9,10,11,12,13,14
DOUT_U173: R874.1 R877.2 R883.2
DOUT_U174: R879.1 R882.2 R888.2
DOUT_U179: R904.1 R907.2 R913.2
DOUT_U180: R909.1 R912.2 R918.2
DOUT_U185: R934.1 R937.2 R943.2
DOUT_U186: R939.1 R942.2 R948.2
DOUT_U191: R964.1 R967.2 ; also sheet 9
DOUT_U192: R969.1 ; also sheet 9
GND: C171.2 C172.2 C173.2 C174.2 C175.2 C176.2 C177.2 C178.2 C179.2 C180.2 C181.2 C182.2 C183.2 C184.2 C185.2 C186.2 C187.2 C188.2 C189.2 C190.2 C191.2 C192.2 C193.2 C194.2 R855.1 R860.1 R865.1 R870.1 R875.1 R880.1 R885.1 R890.1 R895.1 R900.1 R905.1 R910.1 R915.1 R920.1 R925.1 R930.1 R935.1 R940.1 R945.1 R950.1 R955.1 R960.1 R965.1 R970.1 U169.5(GND) U170.5(GND) U171.5(GND) U172.5(GND) U173.5(GND) U174.5(GND) U175.5(GND) U176.5(GND) U177.5(GND) U178.5(GND) U179.5(GND) U180.5(GND) U181.5(GND) U182.5(GND) U183.5(GND) U184.5(GND) U185.5(GND) U186.5(GND) U187.5(GND) U188.5(GND) U189.5(GND) U190.5(GND) U191.5(GND) U192.5(GND) ; also sheet 1,2,3,4,5,6,7,9,10,11,12,13,14
N$10: C171.1 R851.1 U169.9(VDD)
N$43: LD511.K(C) U169.1(R)
N$64: LD512.K(C) U169.2(G)
N$85: LD513.K(C) U169.3(B)
N$106: R852.1 U169.8(DIN)
N$127: R853.1 U169.6(FDIN)
N$148: R854.2 U169.10(DOUT)
N$169: R855.2 U169.7(REXT)
N$190: LD514.K(C) U170.1(R)
N$211: LD515.K(C) U170.2(G)
N$232: LD516.K(C) U170.3(B)
N$253: C172.1 R856.1 U170.9(VDD)
N$274: R857.1 U170.8(DIN)
N$316: R858.1 U170.6(FDIN)
N$379: R859.2 U170.10(DOUT)
N$400: R860.2 U170.7(REXT)
N$421: R859.1 R862.2 R868.2
N$442: C173.1 R861.1 U171.9(VDD)
N$463: LD517.K(C) U171.1(R)
N$484: LD518.K(C) U171.2(G)
N$505: LD519.K(C) U171.3(B)
N$526: R862.1 U171.8(DIN)
N$547: R863.1 U171.6(FDIN)
N$568: R864.2 U171.10(DOUT)
N$589: R865.2 U171.7(REXT)
N$610: LD520.K(C) U172.1(R)
N$631: LD521.K(C) U172.2(G)
N$652: LD522.K(C) U172.3(B)
N$673: C174.1 R866.1 U172.9(VDD)
N$694: R867.1 U172.8(DIN)
N$736: R868.1 U172.6(FDIN)
N$1733: R854.1 R857.2 R863.2
N$1734: R869.2 U172.10(DOUT)
N$1735: R870.2 U172.7(REXT)
N$1736: R869.1 R872.2 R878.2
N$1737: C175.1 R871.1 U173.9(VDD)
N$1738: LD523.K(C) U173.1(R)
N$1739: LD524.K(C) U173.2(G)
N$1740: LD525.K(C) U173.3(B)
N$1741: R872.1 U173.8(DIN)
N$1742: R873.1 U173.6(FDIN)
N$1743: R874.2 U173.10(DOUT)
N$1744: R875.2 U173.7(REXT)
N$1745: LD526.K(C) U174.1(R)
N$1746: LD527.K(C) U174.2(G)
N$1747: LD528.K(C) U174.3(B)
N$1748: C176.1 R876.1 U174.9(VDD)
N$1749: R877.1 U174.8(DIN)
N$1751: R878.1 U174.6(FDIN)
N$1753: R864.1 R867.2 R873.2
N$1754: R879.2 U174.10(DOUT)
N$1755: R880.2 U174.7(REXT)
N$1757: C177.1 R881.1 U175.9(VDD)
N$1758: LD529.K(C) U175.1(R)
N$1759: LD530.K(C) U175.2(G)
N$1760: LD531.K(C) U175.3(B)
N$1761: R882.1 U175.8(DIN)
N$1762: R883.1 U175.6(FDIN)
N$1763: R884.2 U175.10(DOUT)
N$1764: R885.2 U175.7(REXT)
N$1765: LD532.K(C) U176.1(R)
N$1766: LD533.K(C) U176.2(G)
N$1767: LD534.K(C) U176.3(B)
N$1768: C178.1 R886.1 U176.9(VDD)
N$1769: R887.1 U176.8(DIN)
N$1771: R888.1 U176.6(FDIN)
N$1774: R889.2 U176.10(DOUT)
N$1775: R890.2 U176.7(REXT)
N$1776: R889.1 R892.2 R898.2
N$1777: C179.1 R891.1 U177.9(VDD)
N$1778: LD535.K(C) U177.1(R)
N$1779: LD536.K(C) U177.2(G)
N$1780: LD537.K(C) U177.3(B)
N$1781: R892.1 U177.8(DIN)
N$1782: R893.1 U177.6(FDIN)
N$1783: R894.2 U177.10(DOUT)
N$1784: R895.2 U177.7(REXT)
N$1785: LD538.K(C) U178.1(R)
N$1786: LD539.K(C) U178.2(G)
N$1787: LD540.K(C) U178.3(B)
N$1788: C180.1 R896.1 U178.9(VDD)
N$1789: R897.1 U178.8(DIN)
N$1791: R898.1 U178.6(FDIN)
N$1793: R884.1 R887.2 R893.2
N$1794: R899.2 U178.10(DOUT)
N$1795: R900.2 U178.7(REXT)
N$1796: R899.1 R902.2 R908.2
N$1797: C181.1 R901.1 U179.9(VDD)
N$1798: LD541.K(C) U179.1(R)
N$1799: LD542.K(C) U179.2(G)
N$1800: LD543.K(C) U179.3(B)
N$1801: R902.1 U179.8(DIN)
N$1802: R903.1 U179.6(FDIN)
N$1803: R904.2 U179.10(DOUT)
N$1804: R905.2 U179.7(REXT)
N$1805: LD544.K(C) U180.1(R)
N$1806: LD545.K(C) U180.2(G)
N$1807: LD546.K(C) U180.3(B)
N$1808: C182.1 R906.1 U180.9(VDD)
N$1809: R907.1 U180.8(DIN)
N$1811: R908.1 U180.6(FDIN)
N$1813: R894.1 R897.2 R903.2
N$1814: R909.2 U180.10(DOUT)
N$1815: R910.2 U180.7(REXT)
N$1817: C183.1 R911.1 U181.9(VDD)
N$1818: LD547.K(C) U181.1(R)
N$1819: LD548.K(C) U181.2(G)
N$1820: LD549.K(C) U181.3(B)
N$1821: R912.1 U181.8(DIN)
N$1822: R913.1 U181.6(FDIN)
N$1823: R914.2 U181.10(DOUT)
N$1824: R915.2 U181.7(REXT)
N$1825: LD550.K(C) U182.1(R)
N$1826: LD551.K(C) U182.2(G)
N$1827: LD552.K(C) U182.3(B)
N$1828: C184.1 R916.1 U182.9(VDD)
N$1829: R917.1 U182.8(DIN)
N$1831: R918.1 U182.6(FDIN)
N$1834: R919.2 U182.10(DOUT)
N$1835: R920.2 U182.7(REXT)
N$1836: R919.1 R922.2 R928.2
N$1837: C185.1 R921.1 U183.9(VDD)
N$1838: LD553.K(C) U183.1(R)
N$1839: LD554.K(C) U183.2(G)
N$1840: LD555.K(C) U183.3(B)
N$1841: R922.1 U183.8(DIN)
N$1842: R923.1 U183.6(FDIN)
N$1843: R924.2 U183.10(DOUT)
N$1844: R925.2 U183.7(REXT)
N$1845: LD556.K(C) U184.1(R)
N$1846: LD557.K(C) U184.2(G)
N$1847: LD558.K(C) U184.3(B)
N$1848: C186.1 R926.1 U184.9(VDD)
N$1849: R927.1 U184.8(DIN)
N$1851: R928.1 U184.6(FDIN)
N$1853: R914.1 R917.2 R923.2
N$1854: R929.2 U184.10(DOUT)
N$1855: R930.2 U184.7(REXT)
N$1856: R929.1 R932.2 R938.2
N$1857: C187.1 R931.1 U185.9(VDD)
N$1858: LD559.K(C) U185.1(R)
N$1859: LD560.K(C) U185.2(G)
N$1860: LD561.K(C) U185.3(B)
N$1861: R932.1 U185.8(DIN)
N$1862: R933.1 U185.6(FDIN)
N$1863: R934.2 U185.10(DOUT)
N$1864: R935.2 U185.7(REXT)
N$1865: LD562.K(C) U186.1(R)
N$1866: LD563.K(C) U186.2(G)
N$1867: LD564.K(C) U186.3(B)
N$1868: C188.1 R936.1 U186.9(VDD)
N$1869: R937.1 U186.8(DIN)
N$1871: R938.1 U186.6(FDIN)
N$1873: R924.1 R927.2 R933.2
N$1874: R939.2 U186.10(DOUT)
N$1875: R940.2 U186.7(REXT)
N$1877: C189.1 R941.1 U187.9(VDD)
N$1878: LD565.K(C) U187.1(R)
N$1879: LD566.K(C) U187.2(G)
N$1880: LD567.K(C) U187.3(B)
N$1881: R942.1 U187.8(DIN)
N$1882: R943.1 U187.6(FDIN)
N$1883: R944.2 U187.10(DOUT)
N$1884: R945.2 U187.7(REXT)
N$1885: LD568.K(C) U188.1(R)
N$1886: LD569.K(C) U188.2(G)
N$1887: LD570.K(C) U188.3(B)
N$1888: C190.1 R946.1 U188.9(VDD)
N$1889: R947.1 U188.8(DIN)
N$1891: R948.1 U188.6(FDIN)
N$1894: R949.2 U188.10(DOUT)
N$1895: R950.2 U188.7(REXT)
N$1896: R949.1 R952.2 R958.2
N$1897: C191.1 R951.1 U189.9(VDD)
N$1898: LD571.K(C) U189.1(R)
N$1899: LD572.K(C) U189.2(G)
N$1900: LD573.K(C) U189.3(B)
N$1901: R952.1 U189.8(DIN)
N$1902: R953.1 U189.6(FDIN)
N$1903: R954.2 U189.10(DOUT)
N$1904: R955.2 U189.7(REXT)
N$1905: LD574.K(C) U190.1(R)
N$1906: LD575.K(C) U190.2(G)
N$1907: LD576.K(C) U190.3(B)
N$1908: C192.1 R956.1 U190.9(VDD)
N$1909: R957.1 U190.8(DIN)
N$1911: R958.1 U190.6(FDIN)
N$1913: R944.1 R947.2 R953.2
N$1914: R959.2 U190.10(DOUT)
N$1915: R960.2 U190.7(REXT)
N$1916: R959.1 R962.2 R968.2
N$1917: C193.1 R961.1 U191.9(VDD)
N$1918: LD577.K(C) U191.1(R)
N$1919: LD578.K(C) U191.2(G)
N$1920: LD579.K(C) U191.3(B)
N$1921: R962.1 U191.8(DIN)
N$1922: R963.1 U191.6(FDIN)
N$1923: R964.2 U191.10(DOUT)
N$1924: R965.2 U191.7(REXT)
N$1925: LD580.K(C) U192.1(R)
N$1926: LD581.K(C) U192.2(G)
N$1927: LD582.K(C) U192.3(B)
N$1928: C194.1 R966.1 U192.9(VDD)
N$1929: R967.1 U192.8(DIN)
N$1931: R968.1 U192.6(FDIN)
N$1933: R954.1 R957.2 R963.2
N$1934: R969.2 U192.10(DOUT)
N$1935: R970.2 U192.7(REXT)
UNI2_DIN_START: R852.2 R858.2 ; also sheet 1
UNI2_FDIN_START: R853.2
Unconnected: U169.4(W) U170.4(W) U171.4(W) U172.4(W) U173.4(W) U174.4(W) U175.4(W) U176.4(W) U177.4(W) U178.4(W) U179.4(W) U180.4(W) U181.4(W) U182.4(W) U183.4(W) U184.4(W) U185.4(W) U186.4(W) U187.4(W) U188.4(W) U189.4(W) U190.4(W) U191.4(W) U192.4(W)

## Sheet 9 of 17: Row 9
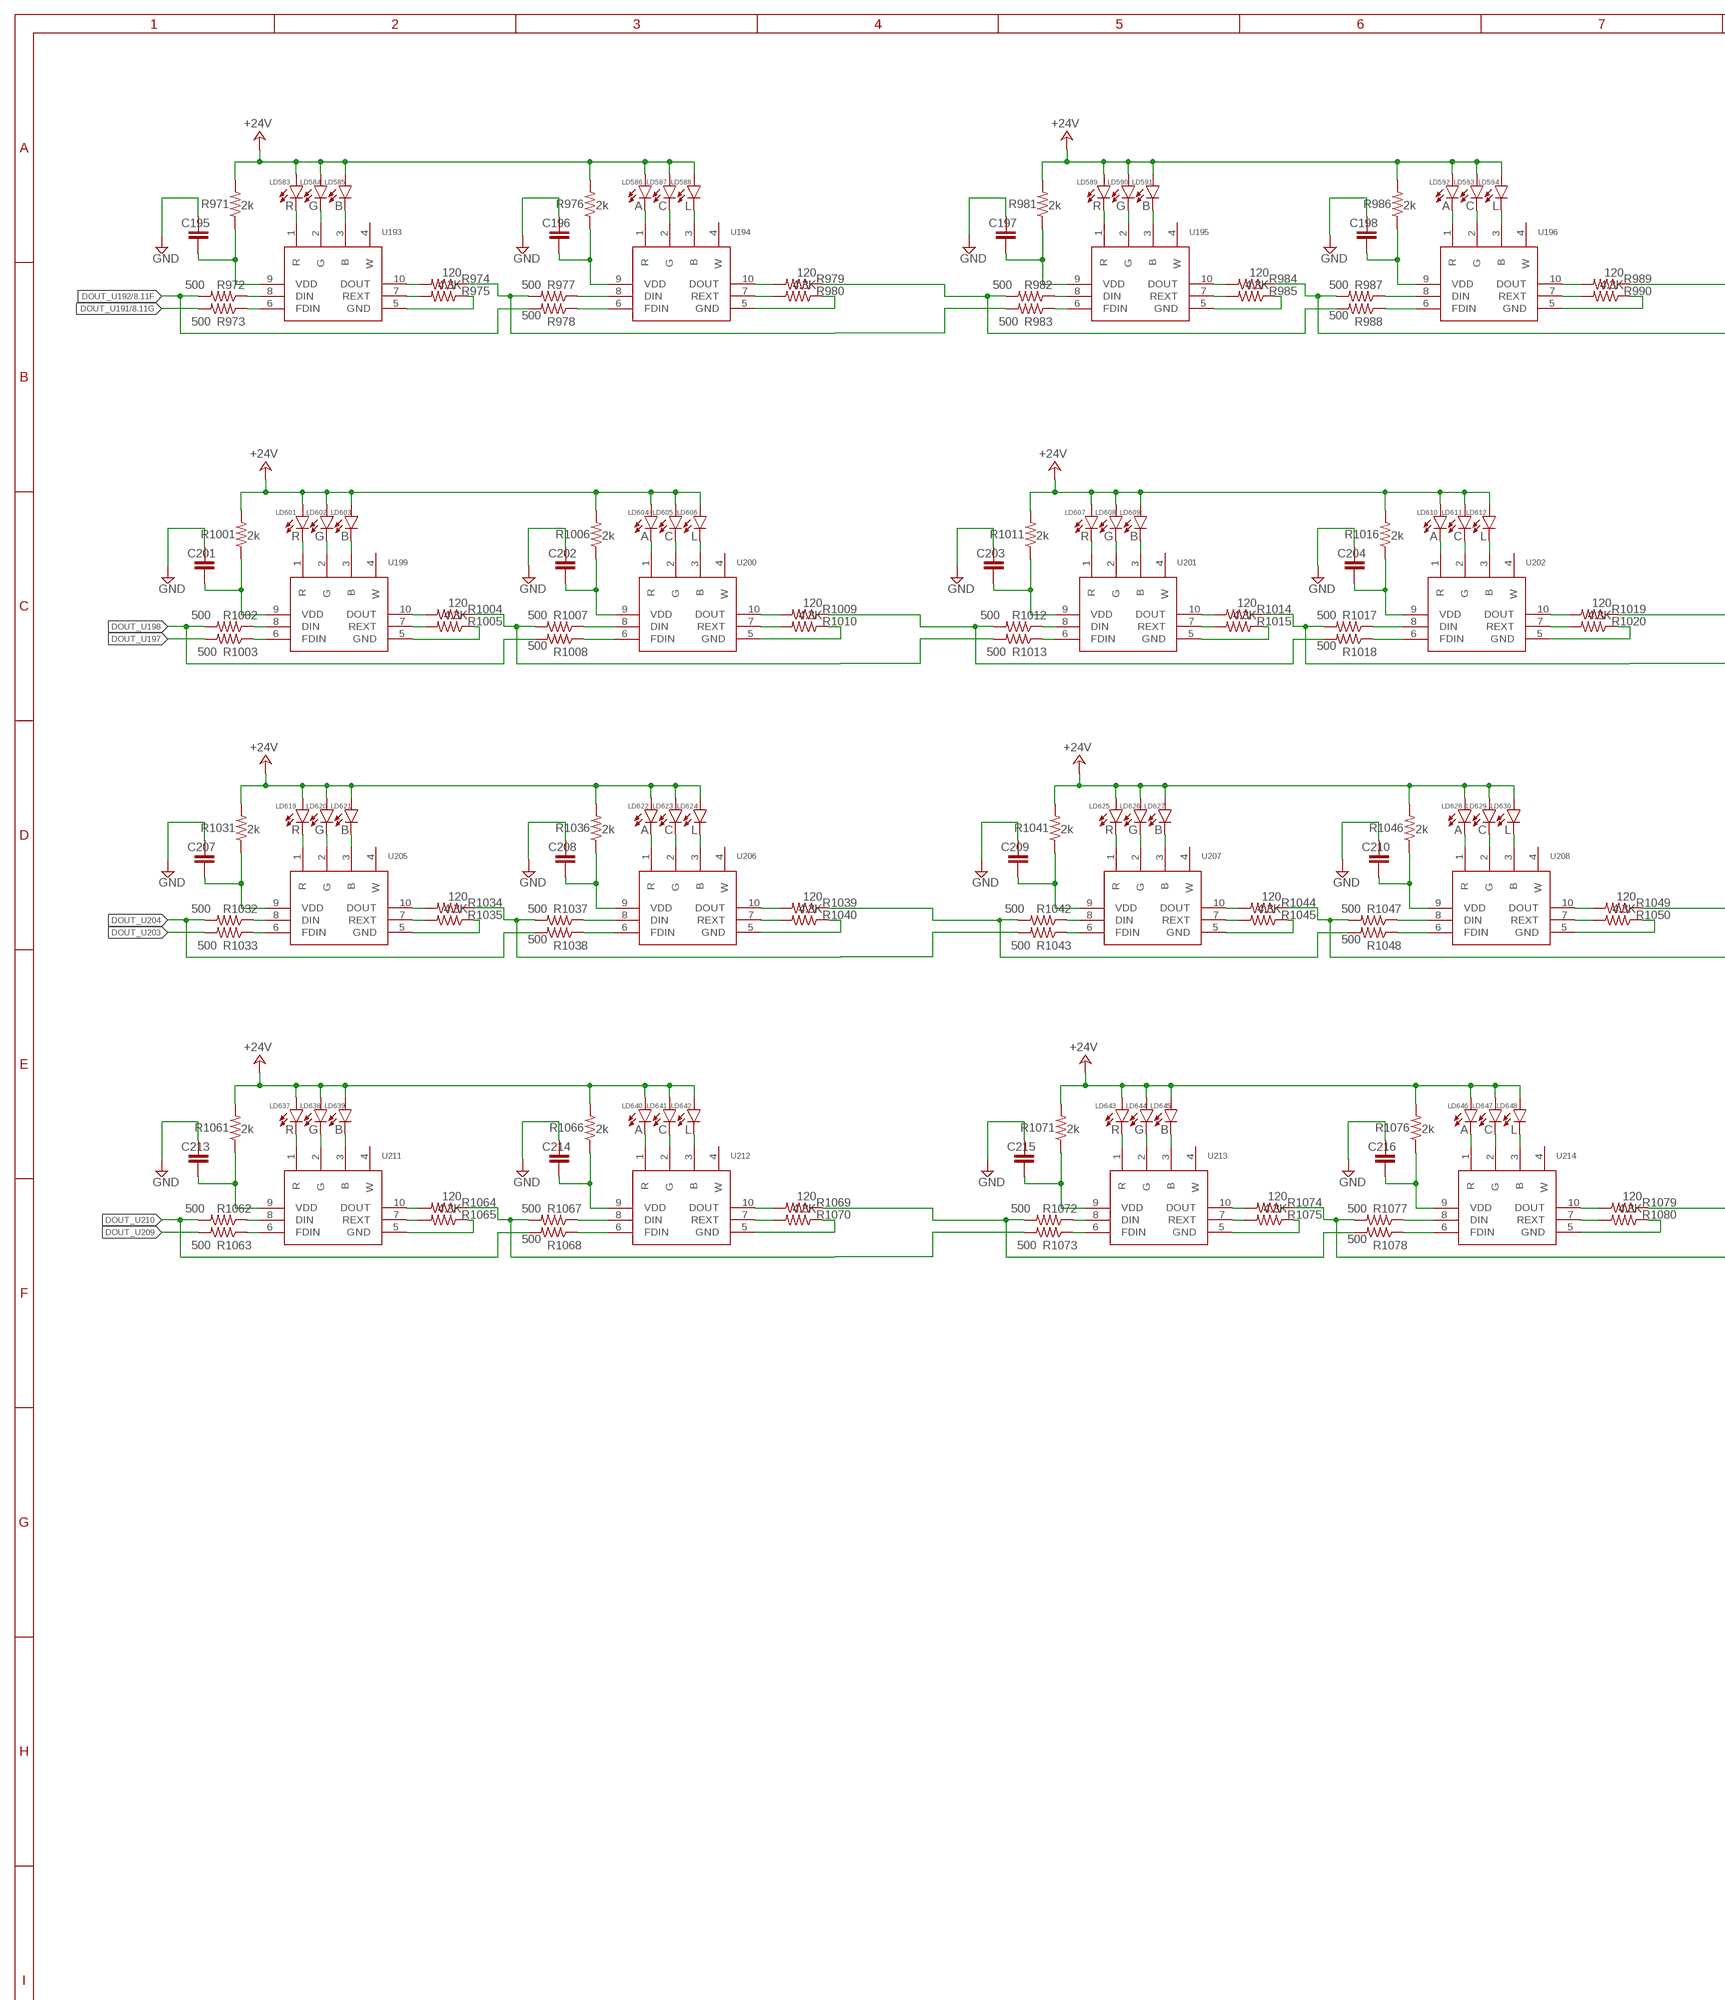
[diagram p16: schematic, sheet 9, part 1 of 2]
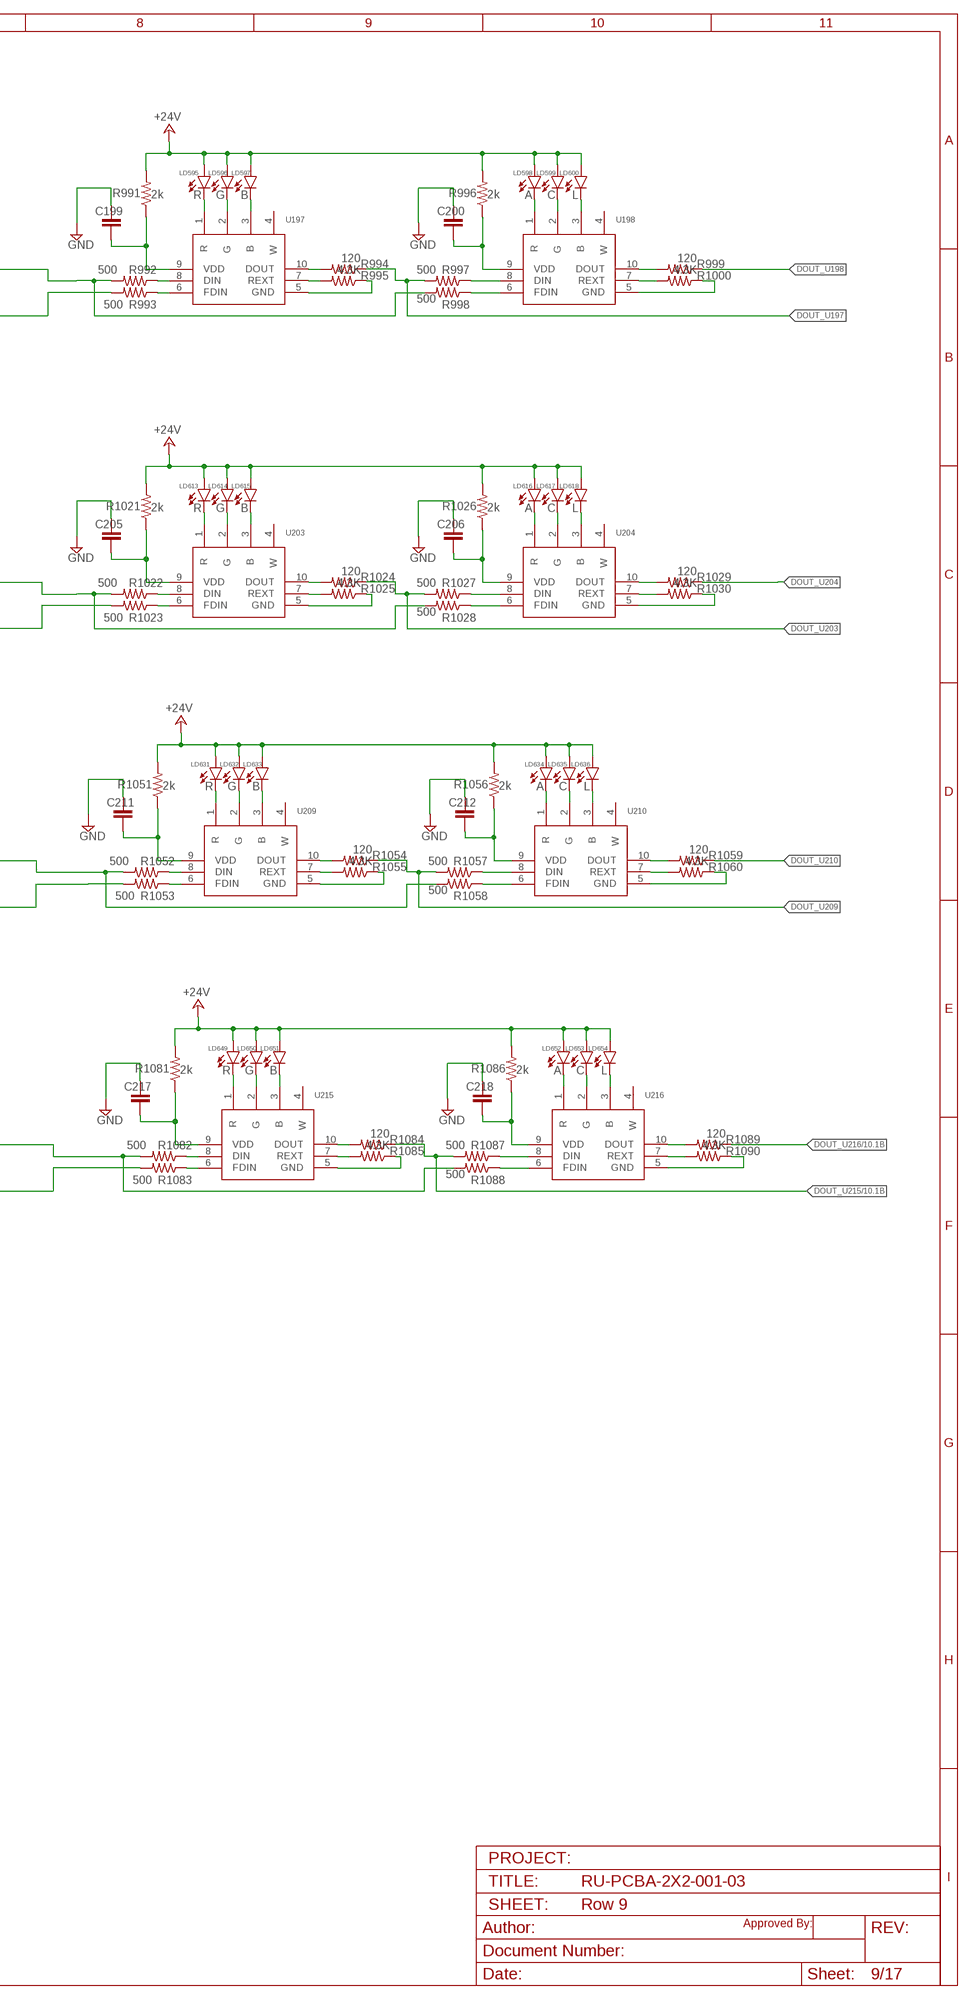
[diagram p17: schematic, sheet 9, part 2 of 2]

### Parts
C195  C-EUC1206  [C1206]
C196  C-EUC1206  [C1206]
C197  C-EUC1206  [C1206]
C198  C-EUC1206  [C1206]
C199  C-EUC1206  [C1206]
C200  C-EUC1206  [C1206]
C201  C-EUC1206  [C1206]
C202  C-EUC1206  [C1206]
C203  C-EUC1206  [C1206]
C204  C-EUC1206  [C1206]
C205  C-EUC1206  [C1206]
C206  C-EUC1206  [C1206]
C207  C-EUC1206  [C1206]
C208  C-EUC1206  [C1206]
C209  C-EUC1206  [C1206]
C210  C-EUC1206  [C1206]
C211  C-EUC1206  [C1206]
C212  C-EUC1206  [C1206]
C213  C-EUC1206  [C1206]
C214  C-EUC1206  [C1206]
C215  C-EUC1206  [C1206]
C216  C-EUC1206  [C1206]
C217  C-EUC1206  [C1206]
C218  C-EUC1206  [C1206]
LD583  R  5050LED  [5050LED]
LD584  G  5050LED  [5050LED]
LD585  B  5050LED  [5050LED]
LD586  A  5050LED  [5050LED]
LD587  C  5050LED  [5050LED]
LD588  L  5050LED  [5050LED]
LD589  R  5050LED  [5050LED]
LD590  G  5050LED  [5050LED]
LD591  B  5050LED  [5050LED]
LD592  A  5050LED  [5050LED]
LD593  C  5050LED  [5050LED]
LD594  L  5050LED  [5050LED]
LD595  R  5050LED  [5050LED]
LD596  G  5050LED  [5050LED]
LD597  B  5050LED  [5050LED]
LD598  A  5050LED  [5050LED]
LD599  C  5050LED  [5050LED]
LD600  L  5050LED  [5050LED]
LD601  R  5050LED  [5050LED]
LD602  G  5050LED  [5050LED]
LD603  B  5050LED  [5050LED]
LD604  A  5050LED  [5050LED]
LD605  C  5050LED  [5050LED]
LD606  L  5050LED  [5050LED]
LD607  R  5050LED  [5050LED]
LD608  G  5050LED  [5050LED]
LD609  B  5050LED  [5050LED]
LD610  A  5050LED  [5050LED]
LD611  C  5050LED  [5050LED]
LD612  L  5050LED  [5050LED]
LD613  R  5050LED  [5050LED]
LD614  G  5050LED  [5050LED]
LD615  B  5050LED  [5050LED]
LD616  A  5050LED  [5050LED]
LD617  C  5050LED  [5050LED]
LD618  L  5050LED  [5050LED]
LD619  R  5050LED  [5050LED]
LD620  G  5050LED  [5050LED]
LD621  B  5050LED  [5050LED]
LD622  A  5050LED  [5050LED]
LD623  C  5050LED  [5050LED]
LD624  L  5050LED  [5050LED]
LD625  R  5050LED  [5050LED]
LD626  G  5050LED  [5050LED]
LD627  B  5050LED  [5050LED]
LD628  A  5050LED  [5050LED]
LD629  C  5050LED  [5050LED]
LD630  L  5050LED  [5050LED]
LD631  R  5050LED  [5050LED]
LD632  G  5050LED  [5050LED]
LD633  B  5050LED  [5050LED]
LD634  A  5050LED  [5050LED]
LD635  C  5050LED  [5050LED]
LD636  L  5050LED  [5050LED]
LD637  R  5050LED  [5050LED]
LD638  G  5050LED  [5050LED]
LD639  B  5050LED  [5050LED]
LD640  A  5050LED  [5050LED]
LD641  C  5050LED  [5050LED]
LD642  L  5050LED  [5050LED]
LD643  R  5050LED  [5050LED]
LD644  G  5050LED  [5050LED]
LD645  B  5050LED  [5050LED]
LD646  A  5050LED  [5050LED]
LD647  C  5050LED  [5050LED]
LD648  L  5050LED  [5050LED]
LD649  R  5050LED  [5050LED]
LD650  G  5050LED  [5050LED]
LD651  B  5050LED  [5050LED]
LD652  A  5050LED  [5050LED]
LD653  C  5050LED  [5050LED]
LD654  L  5050LED  [5050LED]
R971  2k  R-US_R1206  [R1206]
R972  500  R-US_R0805  [R0805]
R973  500  R-US_R0805  [R0805]
R974  120  R-US_R0805  [R0805]
R975  4.3K  R-US_R0805  [R0805]
R976  2k  R-US_R1206  [R1206]
R977  500  R-US_R0805  [R0805]
R978  500  R-US_R0805  [R0805]
R979  120  R-US_R0805  [R0805]
R980  4.3K  R-US_R0805  [R0805]
R981  2k  R-US_R1206  [R1206]
R982  500  R-US_R0805  [R0805]
R983  500  R-US_R0805  [R0805]
R984  120  R-US_R0805  [R0805]
R985  4.3K  R-US_R0805  [R0805]
R986  2k  R-US_R1206  [R1206]
R987  500  R-US_R0805  [R0805]
R988  500  R-US_R0805  [R0805]
R989  120  R-US_R0805  [R0805]
R990  4.3K  R-US_R0805  [R0805]
R991  2k  R-US_R1206  [R1206]
R992  500  R-US_R0805  [R0805]
R993  500  R-US_R0805  [R0805]
R994  120  R-US_R0805  [R0805]
R995  4.3K  R-US_R0805  [R0805]
R996  2k  R-US_R1206  [R1206]
R997  500  R-US_R0805  [R0805]
R998  500  R-US_R0805  [R0805]
R999  120  R-US_R0805  [R0805]
R1000  4.3K  R-US_R0805  [R0805]
R1001  2k  R-US_R1206  [R1206]
R1002  500  R-US_R0805  [R0805]
R1003  500  R-US_R0805  [R0805]
R1004  120  R-US_R0805  [R0805]
R1005  4.3K  R-US_R0805  [R0805]
R1006  2k  R-US_R1206  [R1206]
R1007  500  R-US_R0805  [R0805]
R1008  500  R-US_R0805  [R0805]
R1009  120  R-US_R0805  [R0805]
R1010  4.3K  R-US_R0805  [R0805]
R1011  2k  R-US_R1206  [R1206]
R1012  500  R-US_R0805  [R0805]
R1013  500  R-US_R0805  [R0805]
R1014  120  R-US_R0805  [R0805]
R1015  4.3K  R-US_R0805  [R0805]
R1016  2k  R-US_R1206  [R1206]
R1017  500  R-US_R0805  [R0805]
R1018  500  R-US_R0805  [R0805]
R1019  120  R-US_R0805  [R0805]
R1020  4.3K  R-US_R0805  [R0805]
R1021  2k  R-US_R1206  [R1206]
R1022  500  R-US_R0805  [R0805]
R1023  500  R-US_R0805  [R0805]
R1024  120  R-US_R0805  [R0805]
R1025  4.3K  R-US_R0805  [R0805]
R1026  2k  R-US_R1206  [R1206]
R1027  500  R-US_R0805  [R0805]
R1028  500  R-US_R0805  [R0805]
R1029  120  R-US_R0805  [R0805]
R1030  4.3K  R-US_R0805  [R0805]
R1031  2k  R-US_R1206  [R1206]
R1032  500  R-US_R0805  [R0805]
R1033  500  R-US_R0805  [R0805]
R1034  120  R-US_R0805  [R0805]
R1035  4.3K  R-US_R0805  [R0805]
R1036  2k  R-US_R1206  [R1206]
R1037  500  R-US_R0805  [R0805]
R1038  500  R-US_R0805  [R0805]
R1039  120  R-US_R0805  [R0805]
R1040  4.3K  R-US_R0805  [R0805]
R1041  2k  R-US_R1206  [R1206]
R1042  500  R-US_R0805  [R0805]
R1043  500  R-US_R0805  [R0805]
R1044  120  R-US_R0805  [R0805]
R1045  4.3K  R-US_R0805  [R0805]
R1046  2k  R-US_R1206  [R1206]
R1047  500  R-US_R0805  [R0805]
R1048  500  R-US_R0805  [R0805]
R1049  120  R-US_R0805  [R0805]
R1050  4.3K  R-US_R0805  [R0805]
R1051  2k  R-US_R1206  [R1206]
R1052  500  R-US_R0805  [R0805]
R1053  500  R-US_R0805  [R0805]
R1054  120  R-US_R0805  [R0805]
R1055  4.3K  R-US_R0805  [R0805]
R1056  2k  R-US_R1206  [R1206]
R1057  500  R-US_R0805  [R0805]
R1058  500  R-US_R0805  [R0805]
R1059  120  R-US_R0805  [R0805]
R1060  4.3K  R-US_R0805  [R0805]
R1061  2k  R-US_R1206  [R1206]
R1062  500  R-US_R0805  [R0805]
R1063  500  R-US_R0805  [R0805]
R1064  120  R-US_R0805  [R0805]
R1065  4.3K  R-US_R0805  [R0805]
R1066  2k  R-US_R1206  [R1206]
R1067  500  R-US_R0805  [R0805]
R1068  500  R-US_R0805  [R0805]
R1069  120  R-US_R0805  [R0805]
R1070  4.3K  R-US_R0805  [R0805]
R1071  2k  R-US_R1206  [R1206]
R1072  500  R-US_R0805  [R0805]
R1073  500  R-US_R0805  [R0805]
R1074  120  R-US_R0805  [R0805]
R1075  4.3K  R-US_R0805  [R0805]
R1076  2k  R-US_R1206  [R1206]
R1077  500  R-US_R0805  [R0805]
R1078  500  R-US_R0805  [R0805]
R1079  120  R-US_R0805  [R0805]
R1080  4.3K  R-US_R0805  [R0805]
R1081  2k  R-US_R1206  [R1206]
R1082  500  R-US_R0805  [R0805]
R1083  500  R-US_R0805  [R0805]
R1084  120  R-US_R0805  [R0805]
R1085  4.3K  R-US_R0805  [R0805]
R1086  2k  R-US_R1206  [R1206]
R1087  500  R-US_R0805  [R0805]
R1088  500  R-US_R0805  [R0805]
R1089  120  R-US_R0805  [R0805]
R1090  4.3K  R-US_R0805  [R0805]
U193  UCS7604  [SOP100P600X175-10N]
U194  UCS7604  [SOP100P600X175-10N]
U195  UCS7604  [SOP100P600X175-10N]
U196  UCS7604  [SOP100P600X175-10N]
U197  UCS7604  [SOP100P600X175-10N]
U198  UCS7604  [SOP100P600X175-10N]
U199  UCS7604  [SOP100P600X175-10N]
U200  UCS7604  [SOP100P600X175-10N]
U201  UCS7604  [SOP100P600X175-10N]
U202  UCS7604  [SOP100P600X175-10N]
U203  UCS7604  [SOP100P600X175-10N]
U204  UCS7604  [SOP100P600X175-10N]
U205  UCS7604  [SOP100P600X175-10N]
U206  UCS7604  [SOP100P600X175-10N]
U207  UCS7604  [SOP100P600X175-10N]
U208  UCS7604  [SOP100P600X175-10N]
U209  UCS7604  [SOP100P600X175-10N]
U210  UCS7604  [SOP100P600X175-10N]
U211  UCS7604  [SOP100P600X175-10N]
U212  UCS7604  [SOP100P600X175-10N]
U213  UCS7604  [SOP100P600X175-10N]
U214  UCS7604  [SOP100P600X175-10N]
U215  UCS7604  [SOP100P600X175-10N]
U216  UCS7604  [SOP100P600X175-10N]

### Nets
+24V: LD583.A LD584.A LD585.A LD586.A LD587.A LD588.A LD589.A LD590.A LD591.A LD592.A LD593.A LD594.A LD595.A LD596.A LD597.A LD598.A LD599.A LD600.A LD601.A LD602.A LD603.A LD604.A LD605.A LD606.A LD607.A LD608.A LD609.A LD610.A LD611.A LD612.A LD613.A LD614.A LD615.A LD616.A LD617.A LD618.A LD619.A LD620.A LD621.A LD622.A LD623.A LD624.A LD625.A LD626.A LD627.A LD628.A LD629.A LD630.A LD631.A LD632.A LD633.A LD634.A LD635.A LD636.A LD637.A LD638.A LD639.A LD640.A LD641.A LD642.A LD643.A LD644.A LD645.A LD646.A LD647.A LD648.A LD649.A LD650.A LD651.A LD652.A LD653.A LD654.A R971.2 R976.2 R981.2 R986.2 R991.2 R996.2 R1001.2 R1006.2 R1011.2 R1016.2 R1021.2 R1026.2 R1031.2 R1036.2 R1041.2 R1046.2 R1051.2 R1056.2 R1061.2 R1066.2 R1071.2 R1076.2 R1081.2 R1086.2 ; also sheet 1,2,3,4,5,6,7,8,10,11,12,13,14
DOUT_U191: R973.2 ; also sheet 8
DOUT_U192: R972.2 R978.2 ; also sheet 8
DOUT_U197: R994.1 R997.2 R1003.2
DOUT_U198: R999.1 R1002.2 R1008.2
DOUT_U203: R1024.1 R1027.2 R1033.2
DOUT_U204: R1029.1 R1032.2 R1038.2
DOUT_U209: R1054.1 R1057.2 R1063.2
DOUT_U210: R1059.1 R1062.2 R1068.2
DOUT_U215: R1084.1 R1087.2 ; also sheet 10
DOUT_U216: R1089.1 ; also sheet 10
GND: C195.2 C196.2 C197.2 C198.2 C199.2 C200.2 C201.2 C202.2 C203.2 C204.2 C205.2 C206.2 C207.2 C208.2 C209.2 C210.2 C211.2 C212.2 C213.2 C214.2 C215.2 C216.2 C217.2 C218.2 R975.1 R980.1 R985.1 R990.1 R995.1 R1000.1 R1005.1 R1010.1 R1015.1 R1020.1 R1025.1 R1030.1 R1035.1 R1040.1 R1045.1 R1050.1 R1055.1 R1060.1 R1065.1 R1070.1 R1075.1 R1080.1 R1085.1 R1090.1 U193.5(GND) U194.5(GND) U195.5(GND) U196.5(GND) U197.5(GND) U198.5(GND) U199.5(GND) U200.5(GND) U201.5(GND) U202.5(GND) U203.5(GND) U204.5(GND) U205.5(GND) U206.5(GND) U207.5(GND) U208.5(GND) U209.5(GND) U210.5(GND) U211.5(GND) U212.5(GND) U213.5(GND) U214.5(GND) U215.5(GND) U216.5(GND) ; also sheet 1,2,3,4,5,6,7,8,10,11,12,13,14
N$1937: C195.1 R971.1 U193.9(VDD)
N$1938: LD583.K(C) U193.1(R)
N$1939: LD584.K(C) U193.2(G)
N$1940: LD585.K(C) U193.3(B)
N$1941: R972.1 U193.8(DIN)
N$1942: R973.1 U193.6(FDIN)
N$1943: R974.2 U193.10(DOUT)
N$1944: R975.2 U193.7(REXT)
N$1945: LD586.K(C) U194.1(R)
N$1946: LD587.K(C) U194.2(G)
N$1947: LD588.K(C) U194.3(B)
N$1948: C196.1 R976.1 U194.9(VDD)
N$1949: R977.1 U194.8(DIN)
N$1951: R978.1 U194.6(FDIN)
N$1954: R979.2 U194.10(DOUT)
N$1955: R980.2 U194.7(REXT)
N$1956: R979.1 R982.2 R988.2
N$1957: C197.1 R981.1 U195.9(VDD)
N$1958: LD589.K(C) U195.1(R)
N$1959: LD590.K(C) U195.2(G)
N$1960: LD591.K(C) U195.3(B)
N$1961: R982.1 U195.8(DIN)
N$1962: R983.1 U195.6(FDIN)
N$1963: R984.2 U195.10(DOUT)
N$1964: R985.2 U195.7(REXT)
N$1965: LD592.K(C) U196.1(R)
N$1966: LD593.K(C) U196.2(G)
N$1967: LD594.K(C) U196.3(B)
N$1968: C198.1 R986.1 U196.9(VDD)
N$1969: R987.1 U196.8(DIN)
N$1971: R988.1 U196.6(FDIN)
N$1973: R974.1 R977.2 R983.2
N$1974: R989.2 U196.10(DOUT)
N$1975: R990.2 U196.7(REXT)
N$1976: R989.1 R992.2 R998.2
N$1977: C199.1 R991.1 U197.9(VDD)
N$1978: LD595.K(C) U197.1(R)
N$1979: LD596.K(C) U197.2(G)
N$1980: LD597.K(C) U197.3(B)
N$1981: R992.1 U197.8(DIN)
N$1982: R993.1 U197.6(FDIN)
N$1983: R994.2 U197.10(DOUT)
N$1984: R995.2 U197.7(REXT)
N$1985: LD598.K(C) U198.1(R)
N$1986: LD599.K(C) U198.2(G)
N$1987: LD600.K(C) U198.3(B)
N$1988: C200.1 R996.1 U198.9(VDD)
N$1989: R997.1 U198.8(DIN)
N$1991: R998.1 U198.6(FDIN)
N$1993: R984.1 R987.2 R993.2
N$1994: R999.2 U198.10(DOUT)
N$1995: R1000.2 U198.7(REXT)
N$1997: C201.1 R1001.1 U199.9(VDD)
N$1998: LD601.K(C) U199.1(R)
N$1999: LD602.K(C) U199.2(G)
N$2000: LD603.K(C) U199.3(B)
N$2001: R1002.1 U199.8(DIN)
N$2002: R1003.1 U199.6(FDIN)
N$2003: R1004.2 U199.10(DOUT)
N$2004: R1005.2 U199.7(REXT)
N$2005: LD604.K(C) U200.1(R)
N$2006: LD605.K(C) U200.2(G)
N$2007: LD606.K(C) U200.3(B)
N$2008: C202.1 R1006.1 U200.9(VDD)
N$2009: R1007.1 U200.8(DIN)
N$2011: R1008.1 U200.6(FDIN)
N$2014: R1009.2 U200.10(DOUT)
N$2015: R1010.2 U200.7(REXT)
N$2016: R1009.1 R1012.2 R1018.2
N$2017: C203.1 R1011.1 U201.9(VDD)
N$2018: LD607.K(C) U201.1(R)
N$2019: LD608.K(C) U201.2(G)
N$2020: LD609.K(C) U201.3(B)
N$2021: R1012.1 U201.8(DIN)
N$2022: R1013.1 U201.6(FDIN)
N$2023: R1014.2 U201.10(DOUT)
N$2024: R1015.2 U201.7(REXT)
N$2025: LD610.K(C) U202.1(R)
N$2026: LD611.K(C) U202.2(G)
N$2027: LD612.K(C) U202.3(B)
N$2028: C204.1 R1016.1 U202.9(VDD)
N$2029: R1017.1 U202.8(DIN)
N$2031: R1018.1 U202.6(FDIN)
N$2033: R1004.1 R1007.2 R1013.2
N$2034: R1019.2 U202.10(DOUT)
N$2035: R1020.2 U202.7(REXT)
N$2036: R1019.1 R1022.2 R1028.2
N$2037: C205.1 R1021.1 U203.9(VDD)
N$2038: LD613.K(C) U203.1(R)
N$2039: LD614.K(C) U203.2(G)
N$2040: LD615.K(C) U203.3(B)
N$2041: R1022.1 U203.8(DIN)
N$2042: R1023.1 U203.6(FDIN)
N$2043: R1024.2 U203.10(DOUT)
N$2044: R1025.2 U203.7(REXT)
N$2045: LD616.K(C) U204.1(R)
N$2046: LD617.K(C) U204.2(G)
N$2047: LD618.K(C) U204.3(B)
N$2048: C206.1 R1026.1 U204.9(VDD)
N$2049: R1027.1 U204.8(DIN)
N$2051: R1028.1 U204.6(FDIN)
N$2053: R1014.1 R1017.2 R1023.2
N$2054: R1029.2 U204.10(DOUT)
N$2055: R1030.2 U204.7(REXT)
N$2057: C207.1 R1031.1 U205.9(VDD)
N$2058: LD619.K(C) U205.1(R)
N$2059: LD620.K(C) U205.2(G)
N$2060: LD621.K(C) U205.3(B)
N$2061: R1032.1 U205.8(DIN)
N$2062: R1033.1 U205.6(FDIN)
N$2063: R1034.2 U205.10(DOUT)
N$2064: R1035.2 U205.7(REXT)
N$2065: LD622.K(C) U206.1(R)
N$2066: LD623.K(C) U206.2(G)
N$2067: LD624.K(C) U206.3(B)
N$2068: C208.1 R1036.1 U206.9(VDD)
N$2069: R1037.1 U206.8(DIN)
N$2071: R1038.1 U206.6(FDIN)
N$2074: R1039.2 U206.10(DOUT)
N$2075: R1040.2 U206.7(REXT)
N$2076: R1039.1 R1042.2 R1048.2
N$2077: C209.1 R1041.1 U207.9(VDD)
N$2078: LD625.K(C) U207.1(R)
N$2079: LD626.K(C) U207.2(G)
N$2080: LD627.K(C) U207.3(B)
N$2081: R1042.1 U207.8(DIN)
N$2082: R1043.1 U207.6(FDIN)
N$2083: R1044.2 U207.10(DOUT)
N$2084: R1045.2 U207.7(REXT)
N$2085: LD628.K(C) U208.1(R)
N$2086: LD629.K(C) U208.2(G)
N$2087: LD630.K(C) U208.3(B)
N$2088: C210.1 R1046.1 U208.9(VDD)
N$2089: R1047.1 U208.8(DIN)
N$2090: R1044.1 R1047.2 R1053.2
N$2091: R1048.1 U208.6(FDIN)
N$2093: R1034.1 R1037.2 R1043.2
N$2094: R1049.2 U208.10(DOUT)
N$2095: R1050.2 U208.7(REXT)
N$2096: R1049.1 R1052.2 R1058.2
N$2097: C211.1 R1051.1 U209.9(VDD)
N$2098: LD631.K(C) U209.1(R)
N$2099: LD632.K(C) U209.2(G)
N$2100: LD633.K(C) U209.3(B)
N$2101: R1052.1 U209.8(DIN)
N$2102: R1053.1 U209.6(FDIN)
N$2103: R1054.2 U209.10(DOUT)
N$2104: R1055.2 U209.7(REXT)
N$2105: LD634.K(C) U210.1(R)
N$2106: LD635.K(C) U210.2(G)
N$2107: LD636.K(C) U210.3(B)
N$2108: C212.1 R1056.1 U210.9(VDD)
N$2109: R1057.1 U210.8(DIN)
N$2111: R1058.1 U210.6(FDIN)
N$2114: R1059.2 U210.10(DOUT)
N$2115: R1060.2 U210.7(REXT)
N$2117: C213.1 R1061.1 U211.9(VDD)
N$2118: LD637.K(C) U211.1(R)
N$2119: LD638.K(C) U211.2(G)
N$2120: LD639.K(C) U211.3(B)
N$2121: R1062.1 U211.8(DIN)
N$2122: R1063.1 U211.6(FDIN)
N$2123: R1064.2 U211.10(DOUT)
N$2124: R1065.2 U211.7(REXT)
N$2125: LD640.K(C) U212.1(R)
N$2126: LD641.K(C) U212.2(G)
N$2127: LD642.K(C) U212.3(B)
N$2128: C214.1 R1066.1 U212.9(VDD)
N$2129: R1067.1 U212.8(DIN)
N$2131: R1068.1 U212.6(FDIN)
N$2134: R1069.2 U212.10(DOUT)
N$2135: R1070.2 U212.7(REXT)
N$2136: R1069.1 R1072.2 R1078.2
N$2137: C215.1 R1071.1 U213.9(VDD)
N$2138: LD643.K(C) U213.1(R)
N$2139: LD644.K(C) U213.2(G)
N$2140: LD645.K(C) U213.3(B)
N$2141: R1072.1 U213.8(DIN)
N$2142: R1073.1 U213.6(FDIN)
N$2143: R1074.2 U213.10(DOUT)
N$2144: R1075.2 U213.7(REXT)
N$2145: LD646.K(C) U214.1(R)
N$2146: LD647.K(C) U214.2(G)
N$2147: LD648.K(C) U214.3(B)
N$2148: C216.1 R1076.1 U214.9(VDD)
N$2149: R1077.1 U214.8(DIN)
N$2151: R1078.1 U214.6(FDIN)
N$2153: R1064.1 R1067.2 R1073.2
N$2154: R1079.2 U214.10(DOUT)
N$2155: R1080.2 U214.7(REXT)
N$2156: R1079.1 R1082.2 R1088.2
N$2157: C217.1 R1081.1 U215.9(VDD)
N$2158: LD649.K(C) U215.1(R)
N$2159: LD650.K(C) U215.2(G)
N$2160: LD651.K(C) U215.3(B)
N$2161: R1082.1 U215.8(DIN)
N$2162: R1083.1 U215.6(FDIN)
N$2163: R1084.2 U215.10(DOUT)
N$2164: R1085.2 U215.7(REXT)
N$2165: LD652.K(C) U216.1(R)
N$2166: LD653.K(C) U216.2(G)
N$2167: LD654.K(C) U216.3(B)
N$2168: C218.1 R1086.1 U216.9(VDD)
N$2169: R1087.1 U216.8(DIN)
N$2171: R1088.1 U216.6(FDIN)
N$2173: R1074.1 R1077.2 R1083.2
N$2174: R1089.2 U216.10(DOUT)
N$2175: R1090.2 U216.7(REXT)
Unconnected: U193.4(W) U194.4(W) U195.4(W) U196.4(W) U197.4(W) U198.4(W) U199.4(W) U200.4(W) U201.4(W) U202.4(W) U203.4(W) U204.4(W) U205.4(W) U206.4(W) U207.4(W) U208.4(W) U209.4(W) U210.4(W) U211.4(W) U212.4(W) U213.4(W) U214.4(W) U215.4(W) U216.4(W)